# Altium project TM_DE_Display_REV1.0.PrjPcb
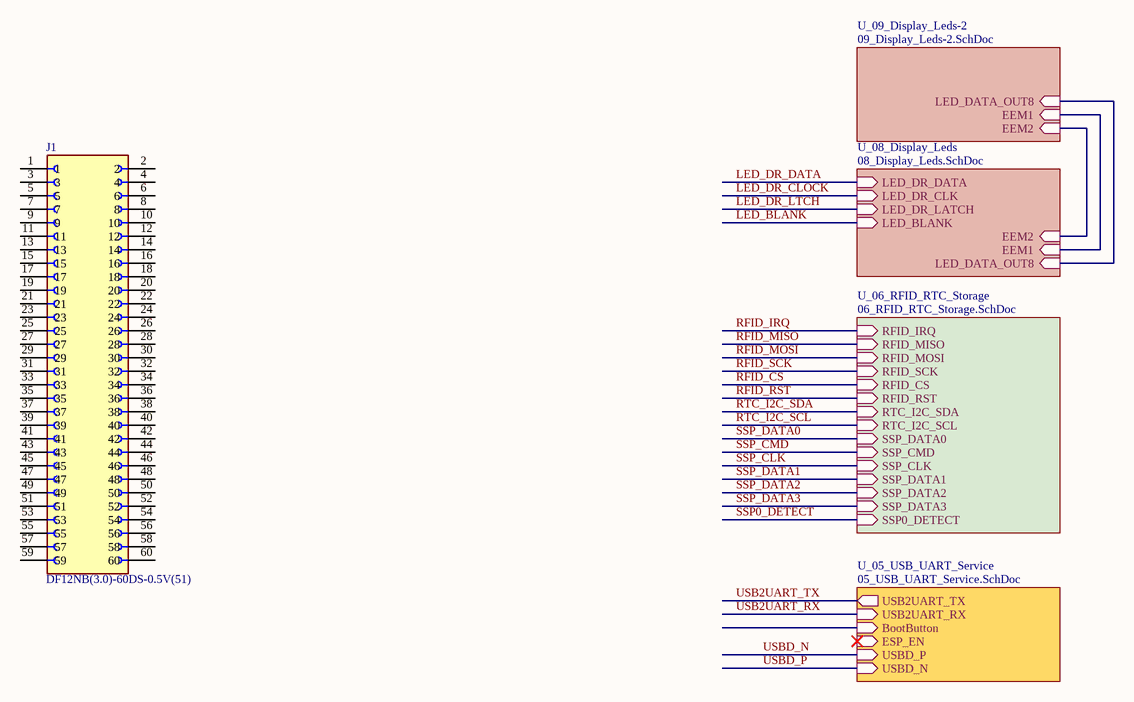
[diagram p0: TOP.SchDoc]
5 sheets, 284 parts. Net scope: hierarchical (ports join the sheet entries above them; power ports are global).
Board file: TM_DE_Display_REV1.0.PcbDoc
Sheets:
  TOP.SchDoc
    U_08_Display_Leds = 08_Display_Leds.SchDoc
    U_09_Display_Leds-2 = 09_Display_Leds-2.SchDoc
    U_05_USB_UART_Service = 05_USB_UART_Service.SchDoc
    U_06_RFID_RTC_Storage = 06_RFID_RTC_Storage.SchDoc

## Sheet TOP.SchDoc: TAXIMETRE_PCB_MAIN
size A4; Author: Burak YALIM; CompanyName: BARFAS; DrawnBy: Burak YALIM; DocumentNumber: 0; SheetNumber: 1; SheetTotal: 12

### Parts
J1  DF12NB(3.0)-60DS-0.5V(51)  [HRS_DF12NB(3.0)-60DS-0.5V(51)]

### Sub-sheets
U_05_USB_UART_Service = 05_USB_UART_Service.SchDoc: USB2UART_TX (out), USB2UART_RX (in), BootButton (in), ESP_EN (in), USBD_P (in), USBD_N (in)
U_06_RFID_RTC_Storage = 06_RFID_RTC_Storage.SchDoc: RFID_IRQ (in), RFID_MISO (in), RFID_MOSI (in), RFID_SCK (in), RFID_CS (in), RFID_RST (in), RTC_I2C_SDA (in), RTC_I2C_SCL (in), SSP_DATA0 (in), SSP_CMD (in), SSP_CLK (in), SSP_DATA1 (in), SSP_DATA2 (in), SSP_DATA3 (in), SSP0_DETECT (in)
U_08_Display_Leds = 08_Display_Leds.SchDoc: LED_DR_DATA (in), LED_DR_CLK (in), LED_DR_LATCH (in), LED_BLANK (in), LED_DATA_OUT8 (in), EEM1 (in), EEM2 (in)
U_09_Display_Leds-2 = 09_Display_Leds-2.SchDoc: LED_DATA_OUT8 (in), EEM1 (in), EEM2 (in)

### Nets
EEM1: sheet U_08_Display_Leds/EEM1, sheet U_09_Display_Leds-2/EEM1
EEM2: sheet U_08_Display_Leds/EEM2, sheet U_09_Display_Leds-2/EEM2
NetU18_22: sheet U_08_Display_Leds/LED_DATA_OUT8, sheet U_09_Display_Leds-2/LED_DATA_OUT8

Not connected (* = marked no-connect by the designer): J1 1 2 3 4 5 6 7 8 9 10 11 12 13 14 15 16 17 18 19 20 21 22 23 24 25 26 27 28 29 30 31 32 33 34 35 36 37 38 39 40 41 42 43 44 45 46 47 48 49 50 51 52 53 54 55 56 57 58 59 60

### Notes on the sheet
- Title
- Size:
- Date:
- A4
- Drawn By:
- Number:
- Revision:
- File:

### Library data of the parts
J1 = DF12NB(3.0)-60DS-0.5V(51): 60 Position Connector Receptacle, Center Strip Contacts Surface Mount Gold; MF: Hirose Electric Co Ltd; SnapEDA_Link: https://www.snapeda.com/parts/DF12NB(3.0)-60DS-0.5V(51)/Hirose/view-part/?ref=snap; Package: None; Value: *; MP: DF12NB(3.0)-60DS-0.5V(51); Check_prices: https://www.snapeda.com/parts/DF12NB(3.0)-60DS-0.5V(51)/Hirose/view-part/?ref=eda

## Sheet 08_Display_Leds.SchDoc
size 558 x 431 mm; SheetNumber: 9; SheetTotal: 12
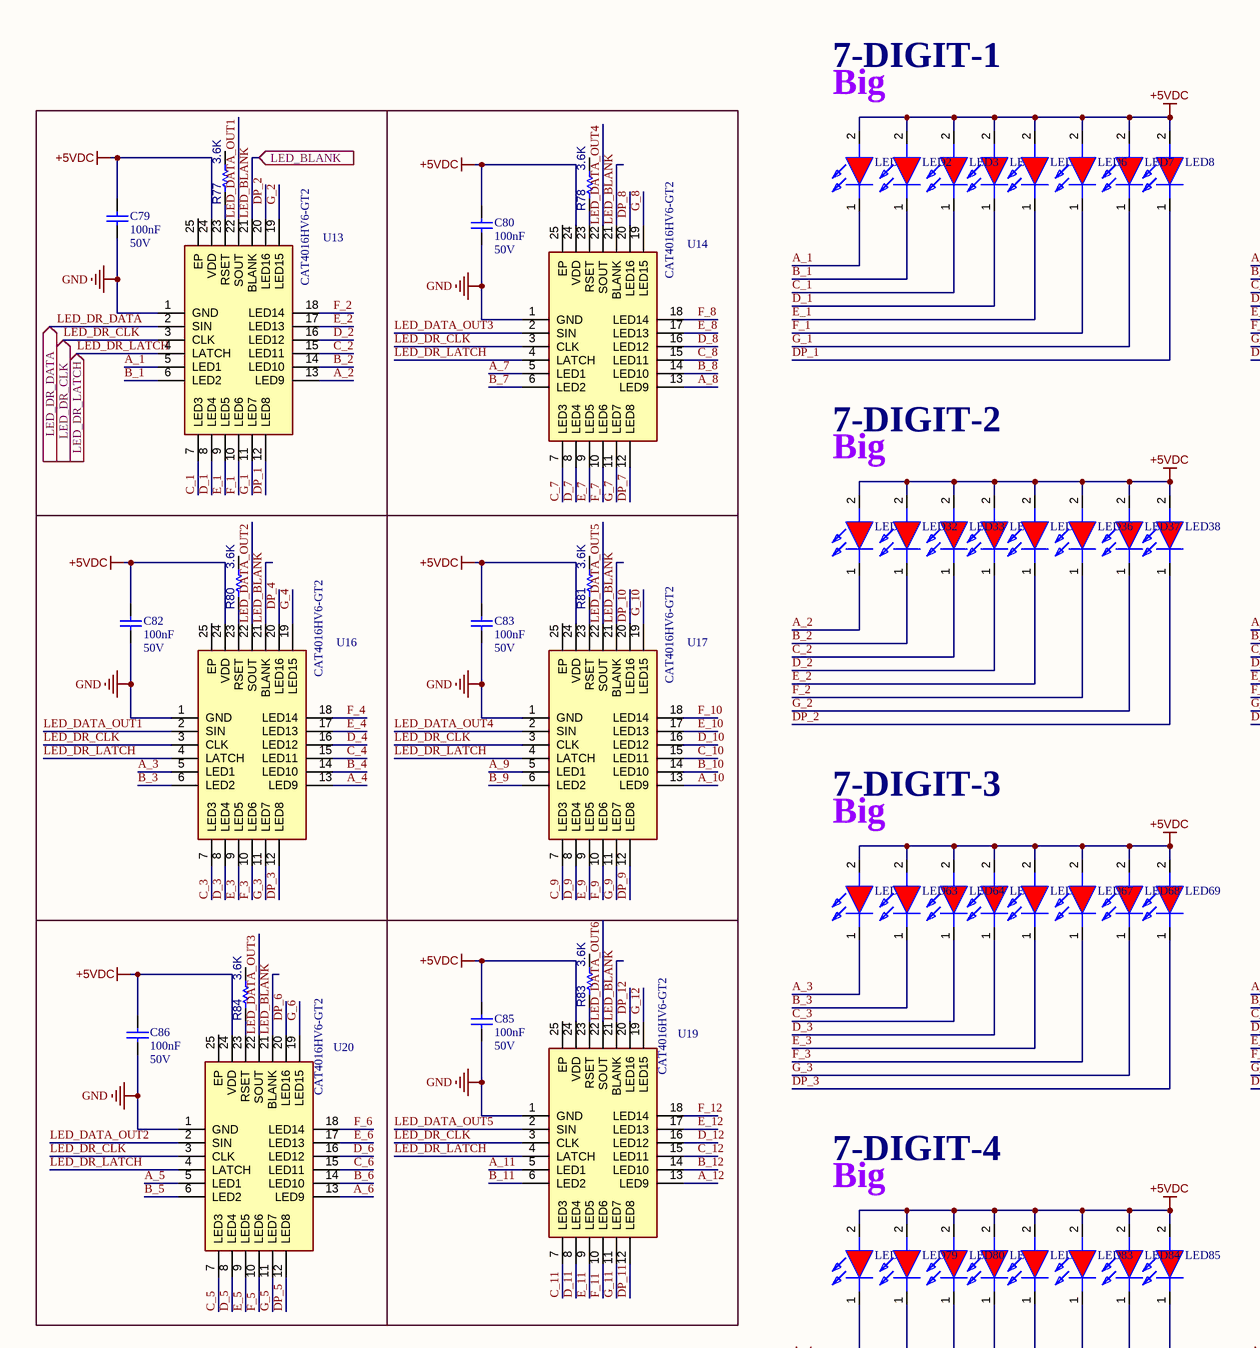
[diagram p1: 08_Display_Leds.SchDoc, top left]
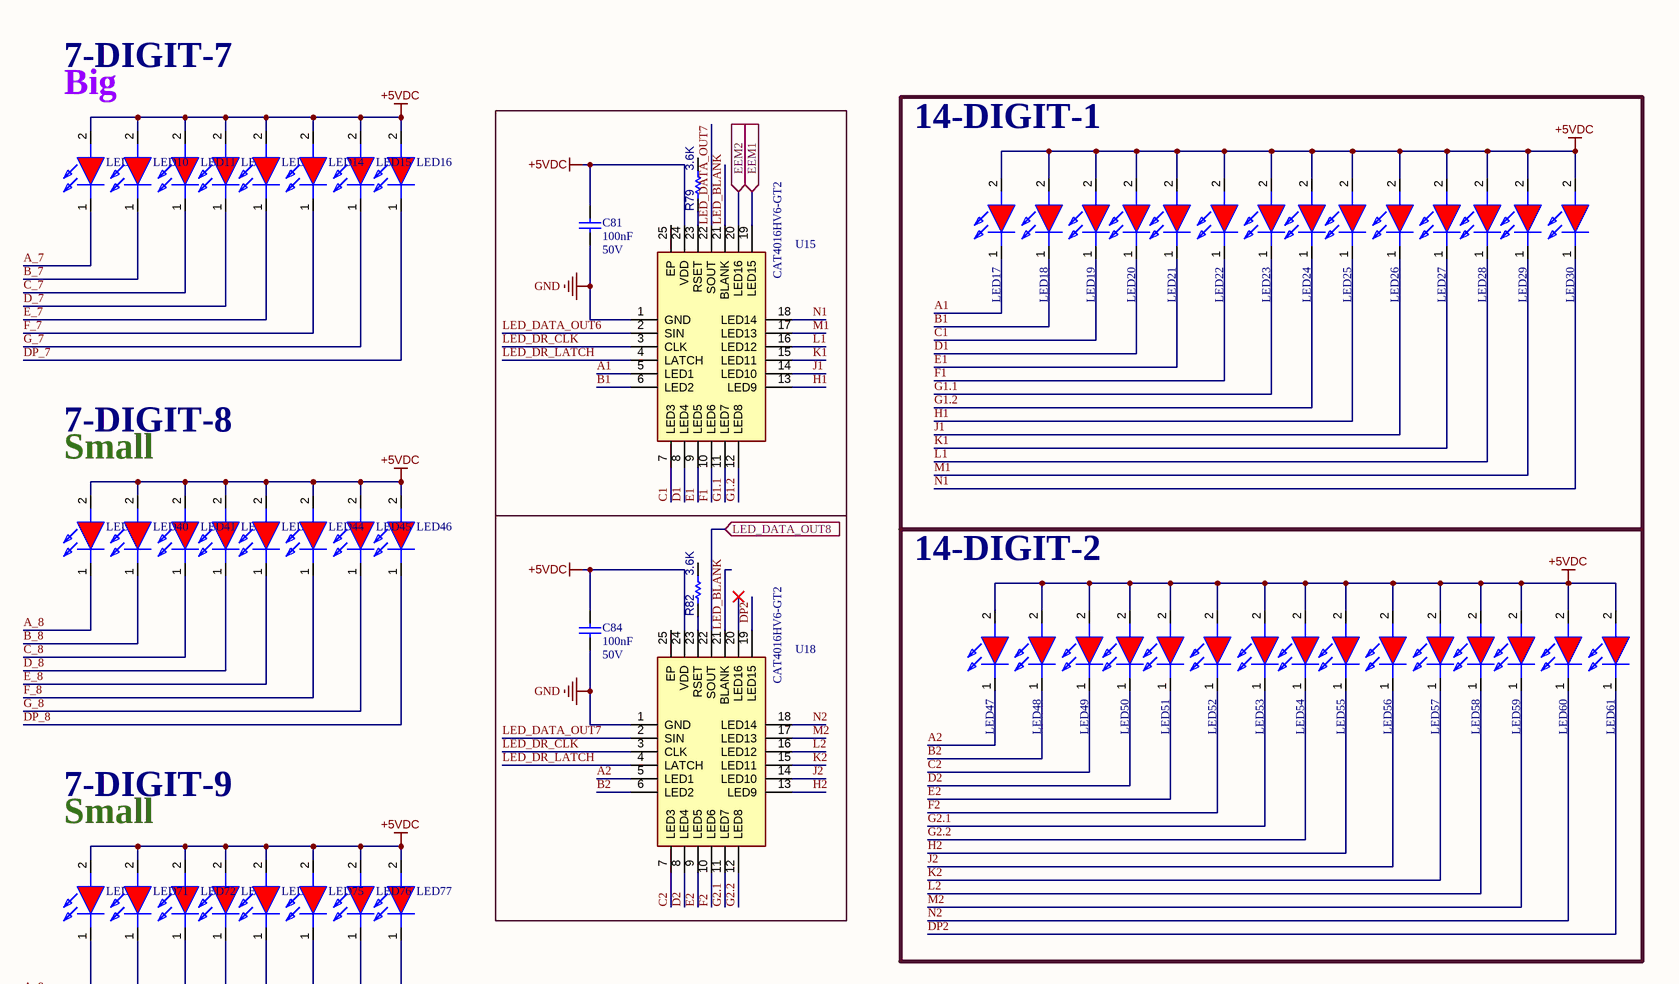
[diagram p2: 08_Display_Leds.SchDoc, top right]
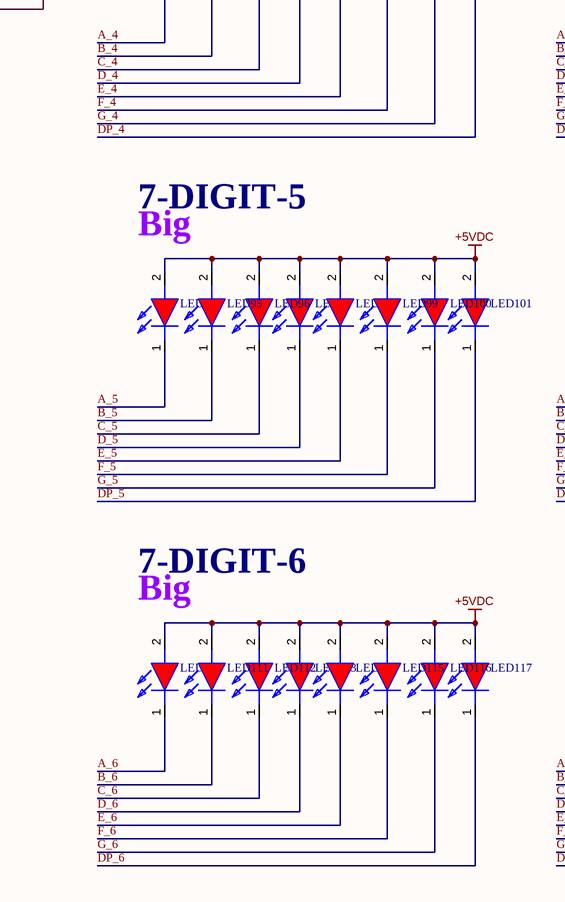
[diagram p3: 08_Display_Leds.SchDoc, bottom left]
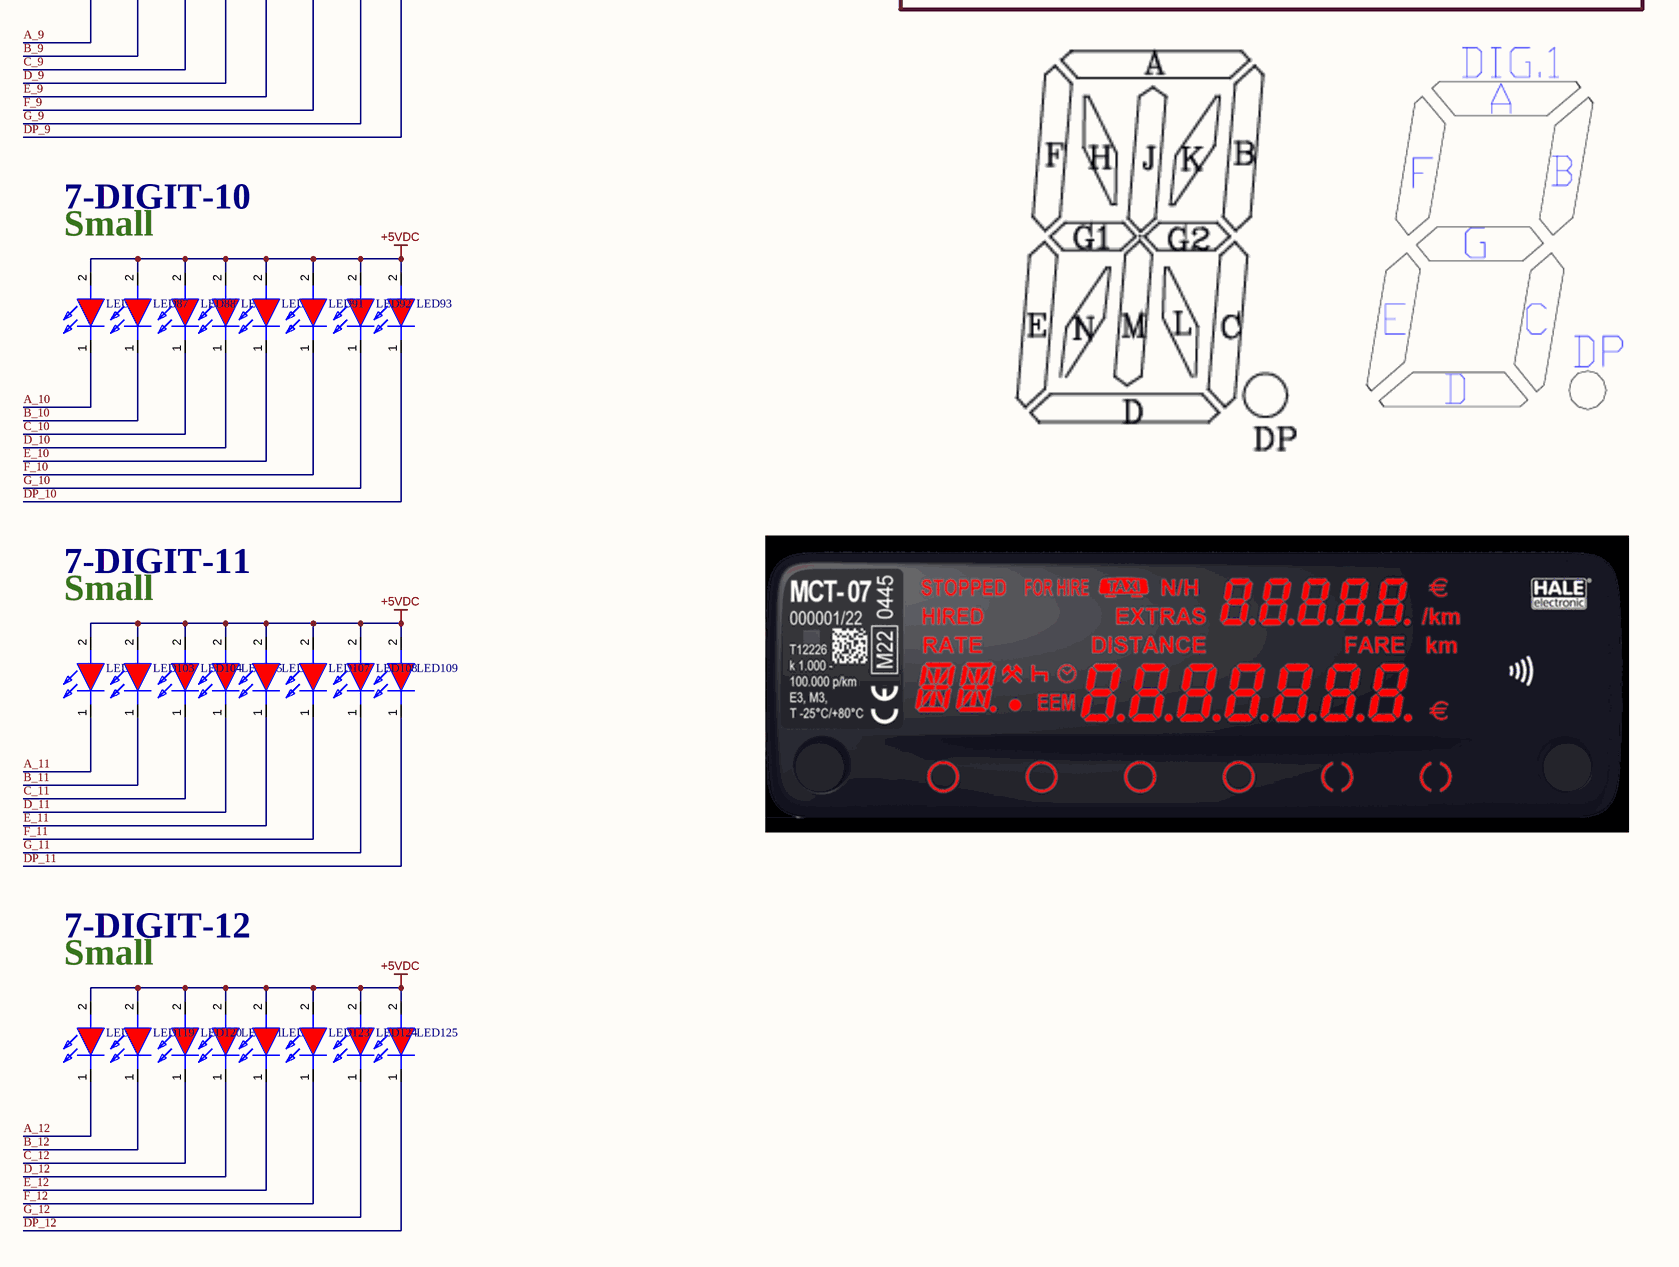
[diagram p4: 08_Display_Leds.SchDoc, bottom right]

### Parts
C79  value 100nF  Voltage: 50V  [CAP_0603]  (hidden comment: CAP)
C80  value 100nF  Voltage: 50V  [CAP_0603]  (hidden comment: CAP)
C81  value 100nF  Voltage: 50V  [CAP_0603]  (hidden comment: CAP)
C82  value 100nF  Voltage: 50V  [CAP_0603]  (hidden comment: CAP)
C83  value 100nF  Voltage: 50V  [CAP_0603]  (hidden comment: CAP)
C84  value 100nF  Voltage: 50V  [CAP_0603]  (hidden comment: CAP)
C85  value 100nF  Voltage: 50V  [CAP_0603]  (hidden comment: CAP)
C86  value 100nF  Voltage: 50V  [CAP_0603]  (hidden comment: CAP)
LED1  YLED0402R  [APHHS1005LSECKJ3PF]  (value not drawn)
LED2  YLED0402R  [APHHS1005LSECKJ3PF]  (value not drawn)
LED3  YLED0402R  [APHHS1005LSECKJ3PF]  (value not drawn)
LED4  YLED0402R  [APHHS1005LSECKJ3PF]  (value not drawn)
LED5  YLED0402R  [APHHS1005LSECKJ3PF]  (value not drawn)
LED6  YLED0402R  [APHHS1005LSECKJ3PF]  (value not drawn)
LED7  YLED0402R  [APHHS1005LSECKJ3PF]  (value not drawn)
LED8  YLED0402R  [APHHS1005LSECKJ3PF]  (value not drawn)
LED9  YLED0402R  [APHHS1005LSECKJ3PF]  (value not drawn)
LED10  YLED0402R  [APHHS1005LSECKJ3PF]  (value not drawn)
LED11  YLED0402R  [APHHS1005LSECKJ3PF]  (value not drawn)
LED12  YLED0402R  [APHHS1005LSECKJ3PF]  (value not drawn)
LED13  YLED0402R  [APHHS1005LSECKJ3PF]  (value not drawn)
LED14  YLED0402R  [APHHS1005LSECKJ3PF]  (value not drawn)
LED15  YLED0402R  [APHHS1005LSECKJ3PF]  (value not drawn)
LED16  YLED0402R  [APHHS1005LSECKJ3PF]  (value not drawn)
LED17  YLED0402R  [APHHS1005LSECKJ3PF]  (value not drawn)
LED18  YLED0402R  [APHHS1005LSECKJ3PF]  (value not drawn)
LED19  YLED0402R  [APHHS1005LSECKJ3PF]  (value not drawn)
LED20  YLED0402R  [APHHS1005LSECKJ3PF]  (value not drawn)
LED21  YLED0402R  [APHHS1005LSECKJ3PF]  (value not drawn)
LED22  YLED0402R  [APHHS1005LSECKJ3PF]  (value not drawn)
LED23  YLED0402R  [APHHS1005LSECKJ3PF]  (value not drawn)
LED24  YLED0402R  [APHHS1005LSECKJ3PF]  (value not drawn)
LED25  YLED0402R  [APHHS1005LSECKJ3PF]  (value not drawn)
LED26  YLED0402R  [APHHS1005LSECKJ3PF]  (value not drawn)
LED27  YLED0402R  [APHHS1005LSECKJ3PF]  (value not drawn)
LED28  YLED0402R  [APHHS1005LSECKJ3PF]  (value not drawn)
LED29  YLED0402R  [APHHS1005LSECKJ3PF]  (value not drawn)
LED30  YLED0402R  [APHHS1005LSECKJ3PF]  (value not drawn)
LED31  YLED0402R  [APHHS1005LSECKJ3PF]  (value not drawn)
LED32  YLED0402R  [APHHS1005LSECKJ3PF]  (value not drawn)
LED33  YLED0402R  [APHHS1005LSECKJ3PF]  (value not drawn)
LED34  YLED0402R  [APHHS1005LSECKJ3PF]  (value not drawn)
LED35  YLED0402R  [APHHS1005LSECKJ3PF]  (value not drawn)
LED36  YLED0402R  [APHHS1005LSECKJ3PF]  (value not drawn)
LED37  YLED0402R  [APHHS1005LSECKJ3PF]  (value not drawn)
LED38  YLED0402R  [APHHS1005LSECKJ3PF]  (value not drawn)
LED39  YLED0402R  [APHHS1005LSECKJ3PF]  (value not drawn)
LED40  YLED0402R  [APHHS1005LSECKJ3PF]  (value not drawn)
LED41  YLED0402R  [APHHS1005LSECKJ3PF]  (value not drawn)
LED42  YLED0402R  [APHHS1005LSECKJ3PF]  (value not drawn)
LED43  YLED0402R  [APHHS1005LSECKJ3PF]  (value not drawn)
LED44  YLED0402R  [APHHS1005LSECKJ3PF]  (value not drawn)
LED45  YLED0402R  [APHHS1005LSECKJ3PF]  (value not drawn)
LED46  YLED0402R  [APHHS1005LSECKJ3PF]  (value not drawn)
LED47  YLED0402R  [APHHS1005LSECKJ3PF]  (value not drawn)
LED48  YLED0402R  [APHHS1005LSECKJ3PF]  (value not drawn)
LED49  YLED0402R  [APHHS1005LSECKJ3PF]  (value not drawn)
LED50  YLED0402R  [APHHS1005LSECKJ3PF]  (value not drawn)
LED51  YLED0402R  [APHHS1005LSECKJ3PF]  (value not drawn)
LED52  YLED0402R  [APHHS1005LSECKJ3PF]  (value not drawn)
LED53  YLED0402R  [APHHS1005LSECKJ3PF]  (value not drawn)
LED54  YLED0402R  [APHHS1005LSECKJ3PF]  (value not drawn)
LED55  YLED0402R  [APHHS1005LSECKJ3PF]  (value not drawn)
LED56  YLED0402R  [APHHS1005LSECKJ3PF]  (value not drawn)
LED57  YLED0402R  [APHHS1005LSECKJ3PF]  (value not drawn)
LED58  YLED0402R  [APHHS1005LSECKJ3PF]  (value not drawn)
LED59  YLED0402R  [APHHS1005LSECKJ3PF]  (value not drawn)
LED60  YLED0402R  [APHHS1005LSECKJ3PF]  (value not drawn)
LED61  YLED0402R  [APHHS1005LSECKJ3PF]  (value not drawn)
LED62  YLED0402R  [APHHS1005LSECKJ3PF]  (value not drawn)
LED63  YLED0402R  [APHHS1005LSECKJ3PF]  (value not drawn)
LED64  YLED0402R  [APHHS1005LSECKJ3PF]  (value not drawn)
LED65  YLED0402R  [APHHS1005LSECKJ3PF]  (value not drawn)
LED66  YLED0402R  [APHHS1005LSECKJ3PF]  (value not drawn)
LED67  YLED0402R  [APHHS1005LSECKJ3PF]  (value not drawn)
LED68  YLED0402R  [APHHS1005LSECKJ3PF]  (value not drawn)
LED69  YLED0402R  [APHHS1005LSECKJ3PF]  (value not drawn)
LED70  YLED0402R  [APHHS1005LSECKJ3PF]  (value not drawn)
LED71  YLED0402R  [APHHS1005LSECKJ3PF]  (value not drawn)
LED72  YLED0402R  [APHHS1005LSECKJ3PF]  (value not drawn)
LED73  YLED0402R  [APHHS1005LSECKJ3PF]  (value not drawn)
LED74  YLED0402R  [APHHS1005LSECKJ3PF]  (value not drawn)
LED75  YLED0402R  [APHHS1005LSECKJ3PF]  (value not drawn)
LED76  YLED0402R  [APHHS1005LSECKJ3PF]  (value not drawn)
LED77  YLED0402R  [APHHS1005LSECKJ3PF]  (value not drawn)
LED78  YLED0402R  [APHHS1005LSECKJ3PF]  (value not drawn)
LED79  YLED0402R  [APHHS1005LSECKJ3PF]  (value not drawn)
LED80  YLED0402R  [APHHS1005LSECKJ3PF]  (value not drawn)
LED81  YLED0402R  [APHHS1005LSECKJ3PF]  (value not drawn)
LED82  YLED0402R  [APHHS1005LSECKJ3PF]  (value not drawn)
LED83  YLED0402R  [APHHS1005LSECKJ3PF]  (value not drawn)
LED84  YLED0402R  [APHHS1005LSECKJ3PF]  (value not drawn)
LED85  YLED0402R  [APHHS1005LSECKJ3PF]  (value not drawn)
LED86  YLED0402R  [APHHS1005LSECKJ3PF]  (value not drawn)
LED87  YLED0402R  [APHHS1005LSECKJ3PF]  (value not drawn)
LED88  YLED0402R  [APHHS1005LSECKJ3PF]  (value not drawn)
LED89  YLED0402R  [APHHS1005LSECKJ3PF]  (value not drawn)
LED90  YLED0402R  [APHHS1005LSECKJ3PF]  (value not drawn)
LED91  YLED0402R  [APHHS1005LSECKJ3PF]  (value not drawn)
LED92  YLED0402R  [APHHS1005LSECKJ3PF]  (value not drawn)
LED93  YLED0402R  [APHHS1005LSECKJ3PF]  (value not drawn)
LED94  YLED0402R  [APHHS1005LSECKJ3PF]  (value not drawn)
LED95  YLED0402R  [APHHS1005LSECKJ3PF]  (value not drawn)
LED96  YLED0402R  [APHHS1005LSECKJ3PF]  (value not drawn)
LED97  YLED0402R  [APHHS1005LSECKJ3PF]  (value not drawn)
LED98  YLED0402R  [APHHS1005LSECKJ3PF]  (value not drawn)
LED99  YLED0402R  [APHHS1005LSECKJ3PF]  (value not drawn)
LED100  YLED0402R  [APHHS1005LSECKJ3PF]  (value not drawn)
LED101  YLED0402R  [APHHS1005LSECKJ3PF]  (value not drawn)
LED102  YLED0402R  [APHHS1005LSECKJ3PF]  (value not drawn)
LED103  YLED0402R  [APHHS1005LSECKJ3PF]  (value not drawn)
LED104  YLED0402R  [APHHS1005LSECKJ3PF]  (value not drawn)
LED105  YLED0402R  [APHHS1005LSECKJ3PF]  (value not drawn)
LED106  YLED0402R  [APHHS1005LSECKJ3PF]  (value not drawn)
LED107  YLED0402R  [APHHS1005LSECKJ3PF]  (value not drawn)
LED108  YLED0402R  [APHHS1005LSECKJ3PF]  (value not drawn)
LED109  YLED0402R  [APHHS1005LSECKJ3PF]  (value not drawn)
LED110  YLED0402R  [APHHS1005LSECKJ3PF]  (value not drawn)
LED111  YLED0402R  [APHHS1005LSECKJ3PF]  (value not drawn)
LED112  YLED0402R  [APHHS1005LSECKJ3PF]  (value not drawn)
LED113  YLED0402R  [APHHS1005LSECKJ3PF]  (value not drawn)
LED114  YLED0402R  [APHHS1005LSECKJ3PF]  (value not drawn)
LED115  YLED0402R  [APHHS1005LSECKJ3PF]  (value not drawn)
LED116  YLED0402R  [APHHS1005LSECKJ3PF]  (value not drawn)
LED117  YLED0402R  [APHHS1005LSECKJ3PF]  (value not drawn)
LED118  YLED0402R  [APHHS1005LSECKJ3PF]  (value not drawn)
LED119  YLED0402R  [APHHS1005LSECKJ3PF]  (value not drawn)
LED120  YLED0402R  [APHHS1005LSECKJ3PF]  (value not drawn)
LED121  YLED0402R  [APHHS1005LSECKJ3PF]  (value not drawn)
LED122  YLED0402R  [APHHS1005LSECKJ3PF]  (value not drawn)
LED123  YLED0402R  [APHHS1005LSECKJ3PF]  (value not drawn)
LED124  YLED0402R  [APHHS1005LSECKJ3PF]  (value not drawn)
LED125  YLED0402R  [APHHS1005LSECKJ3PF]  (value not drawn)
R77  value 3.6K  [RES_0603]  (hidden comment: RC0603FR-133K6L)
R78  value 3.6K  [RES_0603]  (hidden comment: RC0603FR-133K6L)
R79  value 3.6K  [RES_0603]  (hidden comment: RC0603FR-133K6L)
R80  value 3.6K  [RES_0603]  (hidden comment: RC0603FR-133K6L)
R81  value 3.6K  [RES_0603]  (hidden comment: RC0603FR-133K6L)
R82  value 3.6K  [RES_0603]  (hidden comment: RC0603FR-133K6L)
R83  value 3.6K  [RES_0603]  (hidden comment: RC0603FR-133K6L)
R84  value 3.6K  [RES_0603]  (hidden comment: RC0603FR-133K6L)
U13  CAT4016HV6-GT2  [QFN50P400X400X80-25N-D]
U14  CAT4016HV6-GT2  [QFN50P400X400X80-25N-D]
U15  CAT4016HV6-GT2  [QFN50P400X400X80-25N-D]
U16  CAT4016HV6-GT2  [QFN50P400X400X80-25N-D]
U17  CAT4016HV6-GT2  [QFN50P400X400X80-25N-D]
U18  CAT4016HV6-GT2  [QFN50P400X400X80-25N-D]
U19  CAT4016HV6-GT2  [QFN50P400X400X80-25N-D]
U20  CAT4016HV6-GT2  [QFN50P400X400X80-25N-D]

### Blocks framed on the sheet
14-DIGIT-1: LED17-LED30
14-DIGIT-2: LED47-LED61

### Ports
EEM1 (in), EEM2 (in), LED_BLANK (in), LED_DATA_OUT8 (in), LED_DR_CLK (in), LED_DR_DATA (in), LED_DR_LATCH (in)

### Nets
+5VDC: C79.1 C80.1 C81.1 C82.1 C83.1 C84.1 C85.1 C86.1 LED1.2(A) LED2.2(A) LED3.2(A) LED4.2(A) LED5.2(A) LED6.2(A) LED7.2(A) LED8.2(A) LED9.2(A) LED10.2(A) LED11.2(A) LED12.2(A) LED13.2(A) LED14.2(A) LED15.2(A) LED16.2(A) LED17.2(A) LED18.2(A) LED19.2(A) LED20.2(A) LED21.2(A) LED22.2(A) LED23.2(A) LED24.2(A) LED25.2(A) LED26.2(A) LED27.2(A) LED28.2(A) LED29.2(A) LED30.2(A) LED31.2(A) LED32.2(A) LED33.2(A) LED34.2(A) LED35.2(A) LED36.2(A) LED37.2(A) LED38.2(A) LED39.2(A) LED40.2(A) LED41.2(A) LED42.2(A) LED43.2(A) LED44.2(A) LED45.2(A) LED46.2(A) LED47.2(A) LED48.2(A) LED49.2(A) LED50.2(A) LED51.2(A) LED52.2(A) LED53.2(A) LED54.2(A) LED55.2(A) LED56.2(A) LED57.2(A) LED58.2(A) LED59.2(A) LED60.2(A) LED61.2(A) LED62.2(A) LED63.2(A) LED64.2(A) LED65.2(A) LED66.2(A) LED67.2(A) LED68.2(A) LED69.2(A) LED70.2(A) LED71.2(A) LED72.2(A) LED73.2(A) LED74.2(A) LED75.2(A) LED76.2(A) LED77.2(A) LED78.2(A) LED79.2(A) LED80.2(A) LED81.2(A) LED82.2(A) LED83.2(A) LED84.2(A) LED85.2(A) LED86.2(A) LED87.2(A) LED88.2(A) LED89.2(A) LED90.2(A) LED91.2(A) LED92.2(A) LED93.2(A) LED94.2(A) LED95.2(A) LED96.2(A) LED97.2(A) LED98.2(A) LED99.2(A) LED100.2(A) LED101.2(A) LED102.2(A) LED103.2(A) LED104.2(A) LED105.2(A) LED106.2(A) LED107.2(A) LED108.2(A) LED109.2(A) LED110.2(A) LED111.2(A) LED112.2(A) LED113.2(A) LED114.2(A) LED115.2(A) LED116.2(A) LED117.2(A) LED118.2(A) LED119.2(A) LED120.2(A) LED121.2(A) LED122.2(A) LED123.2(A) LED124.2(A) LED125.2(A) U13.24(VDD) U14.24(VDD) U15.24(VDD) U16.24(VDD) U17.24(VDD) U18.24(VDD) U19.24(VDD) U20.24(VDD)
GND: C79.2 C80.2 C81.2 C82.2 C83.2 C84.2 C85.2 C86.2 U13.1(GND) U14.1(GND) U15.1(GND) U16.1(GND) U17.1(GND) U18.1(GND) U19.1(GND) U20.1(GND)
A1: LED17.1(K) U15.5(LED1)
A2: LED47.1(K) U18.5(LED1)
A_1: LED1.1(K) U13.5(LED1)
A_2: LED31.1(K) U13.13(LED9)
A_3: LED62.1(K) U16.5(LED1)
A_4: LED78.1(K) U16.13(LED9)
A_5: LED94.1(K) U20.5(LED1)
A_6: LED110.1(K) U20.13(LED9)
A_7: LED9.1(K) U14.5(LED1)
A_8: LED39.1(K) U14.13(LED9)
A_9: LED70.1(K) U17.5(LED1)
A_10: LED86.1(K) U17.13(LED9)
A_11: LED102.1(K) U19.5(LED1)
A_12: LED118.1(K) U19.13(LED9)
B1: LED18.1(K) U15.6(LED2)
B2: LED48.1(K) U18.6(LED2)
B_1: LED2.1(K) U13.6(LED2)
B_2: LED32.1(K) U13.14(LED10)
B_3: LED63.1(K) U16.6(LED2)
B_4: LED79.1(K) U16.14(LED10)
B_5: LED95.1(K) U20.6(LED2)
B_6: LED111.1(K) U20.14(LED10)
B_7: LED10.1(K) U14.6(LED2)
B_8: LED40.1(K) U14.14(LED10)
B_9: LED71.1(K) U17.6(LED2)
B_10: LED87.1(K) U17.14(LED10)
B_11: LED103.1(K) U19.6(LED2)
B_12: LED119.1(K) U19.14(LED10)
C1: LED19.1(K) U15.7(LED3)
C2: LED49.1(K) U18.7(LED3)
C_1: LED3.1(K) U13.7(LED3)
C_2: LED33.1(K) U13.15(LED11)
C_3: LED64.1(K) U16.7(LED3)
C_4: LED80.1(K) U16.15(LED11)
C_5: LED96.1(K) U20.7(LED3)
C_6: LED112.1(K) U20.15(LED11)
C_7: LED11.1(K) U14.7(LED3)
C_8: LED41.1(K) U14.15(LED11)
C_9: LED72.1(K) U17.7(LED3)
C_10: LED88.1(K) U17.15(LED11)
C_11: LED104.1(K) U19.7(LED3)
C_12: LED120.1(K) U19.15(LED11)
D1: LED20.1(K) U15.8(LED4)
D2: LED50.1(K) U18.8(LED4)
D_1: LED4.1(K) U13.8(LED4)
D_2: LED34.1(K) U13.16(LED12)
D_3: LED65.1(K) U16.8(LED4)
D_4: LED81.1(K) U16.16(LED12)
D_5: LED97.1(K) U20.8(LED4)
D_6: LED113.1(K) U20.16(LED12)
D_7: LED12.1(K) U14.8(LED4)
D_8: LED42.1(K) U14.16(LED12)
D_9: LED73.1(K) U17.8(LED4)
D_10: LED89.1(K) U17.16(LED12)
D_11: LED105.1(K) U19.8(LED4)
D_12: LED121.1(K) U19.16(LED12)
DP2: LED61.1(K) U18.19(LED15)
DP_1: LED8.1(K) U13.12(LED8)
DP_2: LED38.1(K) U13.20(LED16)
DP_3: LED69.1(K) U16.12(LED8)
DP_4: LED85.1(K) U16.20(LED16)
DP_5: LED101.1(K) U20.12(LED8)
DP_6: LED117.1(K) U20.20(LED16)
DP_7: LED16.1(K) U14.12(LED8)
DP_8: LED46.1(K) U14.20(LED16)
DP_9: LED77.1(K) U17.12(LED8)
DP_10: LED93.1(K) U17.20(LED16)
DP_11: LED109.1(K) U19.12(LED8)
DP_12: LED125.1(K) U19.20(LED16)
E1: LED21.1(K) U15.9(LED5)
E2: LED51.1(K) U18.9(LED5)
E_1: LED5.1(K) U13.9(LED5)
E_2: LED35.1(K) U13.17(LED13)
E_3: LED66.1(K) U16.9(LED5)
E_4: LED82.1(K) U16.17(LED13)
E_5: LED98.1(K) U20.9(LED5)
E_6: LED114.1(K) U20.17(LED13)
E_7: LED13.1(K) U14.9(LED5)
E_8: LED43.1(K) U14.17(LED13)
E_9: LED74.1(K) U17.9(LED5)
E_10: LED90.1(K) U17.17(LED13)
E_11: LED106.1(K) U19.9(LED5)
E_12: LED122.1(K) U19.17(LED13)
EEM1: U15.19(LED15) ; port EEM1
EEM2: U15.20(LED16) ; port EEM2
F1: LED22.1(K) U15.10(LED6)
F2: LED52.1(K) U18.10(LED6)
F_1: LED6.1(K) U13.10(LED6)
F_2: LED36.1(K) U13.18(LED14)
F_3: LED67.1(K) U16.10(LED6)
F_4: LED83.1(K) U16.18(LED14)
F_5: LED99.1(K) U20.10(LED6)
F_6: LED115.1(K) U20.18(LED14)
F_7: LED14.1(K) U14.10(LED6)
F_8: LED44.1(K) U14.18(LED14)
F_9: LED75.1(K) U17.10(LED6)
F_10: LED91.1(K) U17.18(LED14)
F_11: LED107.1(K) U19.10(LED6)
F_12: LED123.1(K) U19.18(LED14)
G1.1: LED23.1(K) U15.11(LED7)
G1.2: LED24.1(K) U15.12(LED8)
G2.1: LED53.1(K) U18.11(LED7)
G2.2: LED54.1(K) U18.12(LED8)
G_1: LED7.1(K) U13.11(LED7)
G_2: LED37.1(K) U13.19(LED15)
G_3: LED68.1(K) U16.11(LED7)
G_4: LED84.1(K) U16.19(LED15)
G_5: LED100.1(K) U20.11(LED7)
G_6: LED116.1(K) U20.19(LED15)
G_7: LED15.1(K) U14.11(LED7)
G_8: LED45.1(K) U14.19(LED15)
G_9: LED76.1(K) U17.11(LED7)
G_10: LED92.1(K) U17.19(LED15)
G_11: LED108.1(K) U19.11(LED7)
G_12: LED124.1(K) U19.19(LED15)
H1: LED25.1(K) U15.13(LED9)
H2: LED55.1(K) U18.13(LED9)
J1: LED26.1(K) U15.14(LED10)
J2: LED56.1(K) U18.14(LED10)
K1: LED27.1(K) U15.15(LED11)
K2: LED57.1(K) U18.15(LED11)
L1: LED28.1(K) U15.16(LED12)
L2: LED58.1(K) U18.16(LED12)
LED_BLANK: U13.21(BLANK) U14.21(BLANK) U15.21(BLANK) U16.21(BLANK) U17.21(BLANK) U18.21(BLANK) U19.21(BLANK) U20.21(BLANK) ; port LED_BLANK
LED_DATA_OUT1: U13.22(SOUT) U16.2(SIN)
LED_DATA_OUT2: U16.22(SOUT) U20.2(SIN)
LED_DATA_OUT3: U14.2(SIN) U20.22(SOUT)
LED_DATA_OUT4: U14.22(SOUT) U17.2(SIN)
LED_DATA_OUT5: U17.22(SOUT) U19.2(SIN)
LED_DATA_OUT6: U15.2(SIN) U19.22(SOUT)
LED_DATA_OUT7: U15.22(SOUT) U18.2(SIN)
LED_DR_CLK: U13.3(CLK) U14.3(CLK) U15.3(CLK) U16.3(CLK) U17.3(CLK) U18.3(CLK) U19.3(CLK) U20.3(CLK) ; port LED_DR_CLK
LED_DR_DATA: U13.2(SIN) ; port LED_DR_DATA
LED_DR_LATCH: U13.4(LATCH) U14.4(LATCH) U15.4(LATCH) U16.4(LATCH) U17.4(LATCH) U18.4(LATCH) U19.4(LATCH) U20.4(LATCH) ; port LED_DR_LATCH
M1: LED29.1(K) U15.17(LED13)
M2: LED59.1(K) U18.17(LED13)
N1: LED30.1(K) U15.18(LED14)
N2: LED60.1(K) U18.18(LED14)
NetR77_1: R77.1 U13.23(RSET)
NetR78_1: R78.1 U14.23(RSET)
NetR79_1: R79.1 U15.23(RSET)
NetR80_1: R80.1 U16.23(RSET)
NetR81_1: R81.1 U17.23(RSET)
NetR82_1: R82.1 U18.23(RSET)
NetR83_1: R83.1 U19.23(RSET)
NetR84_1: R84.1 U20.23(RSET)
NetU18_22: U18.22(SOUT) ; port LED_DATA_OUT8

Not connected (* = marked no-connect by the designer): R77 2; R78 2; R79 2; R80 2; R81 2; R82 2; R83 2; R84 2; U13 25(EP); U14 25(EP); U15 25(EP); U16 25(EP); U17 25(EP); U18 20(LED16)* 25(EP); U19 25(EP); U20 25(EP)

### Notes on the sheet
- 7-DIGIT-1
- Big
- 7-DIGIT-7
- 7-DIGIT-2
- 7-DIGIT-8
- Small
- 7-DIGIT-3
- 7-DIGIT-9
- 7-DIGIT-4
- 7-DIGIT-10
- 7-DIGIT-5
- 7-DIGIT-11
- 7-DIGIT-6
- 7-DIGIT-12
- DWG. NO.
- REV.
- SHT.
- REVISION
- DESCRIPTION
- DATE
- APPROVED
- THIS DOCUMENT AND THE DATA DISCLOSED HEREIN OR HEREWITH IS THE PROPERTY OF ALTIUM LIMITED AND MAY BE FREELY DISTRIBUTED IN WHOLE. NO RIGHTS ARE RESERVED OR EXPRESS OR IMPLIED WARANTEE GIVEN.
- ENG:
- DSN:
- APPROVALS
- PROJECT
- DOCUMENT REVISION:
- DESIGN ITEM:
- CHK:
- BOM:
- REFERENCE DOCUMENTS
- PROJECT REVISION:
- TITLE
- FAB DWG:
- PCB DWG:
- ASSY DWG:
- SCALE:
- SIZE
- C
- CAGE CODE
- FILE NAME
- DWG NO.
- SHEET
- OF
- REV

### Library data of the parts
C79-C86 = C01763: CAP CER 100nF 50VDC %10 X7R SMD; Manufacturer: Samsung; Manufacturer Part Number: CL10B104KB8NNNL
LED1-LED125 = YLED0402R: LED RED WATER CLEAR 0402 SMD; Manufacturer: Kingbright; Value: 0402; Manufacturer Part Number: YLED0402R
R77-R84 = 0603SAF3301T5E: RES.(1608) 0603 3.6K Ohms 1% 1/10W 100PPM SMT; Manufacturer: YAGEO; Manufacturer Part Number: RC0603FR-133K6L
U13-U20 = CAT4016HV6-GT2: Integrated Circuit; Manufacturer_Name: onsemi; Datasheet Link: https://www.onsemi.com/download/data-sheet/pdf/cat4016-d.pdf; Height: 0.8mm; Manufacturer_Part_Number: CAT4016HV6-GT2; Mouser Part Number: 698-CAT4016HV6-GT2; Mouser Price/Stock: https://www.mouser.co.uk/ProductDetail/onsemi/CAT4016HV6-GT2?qs=rZgeL6XvLwaPp0eUTTX%2FiA%3D%3D; Arrow Part Number: CAT4016HV6-GT2; Arrow Price/Stock: https://www.arrow.com/en/products/cat4016hv6-gt2/on-semiconductor

## Sheet 09_Display_Leds-2.SchDoc
size 558 x 431 mm; SheetNumber: 10; SheetTotal: 12
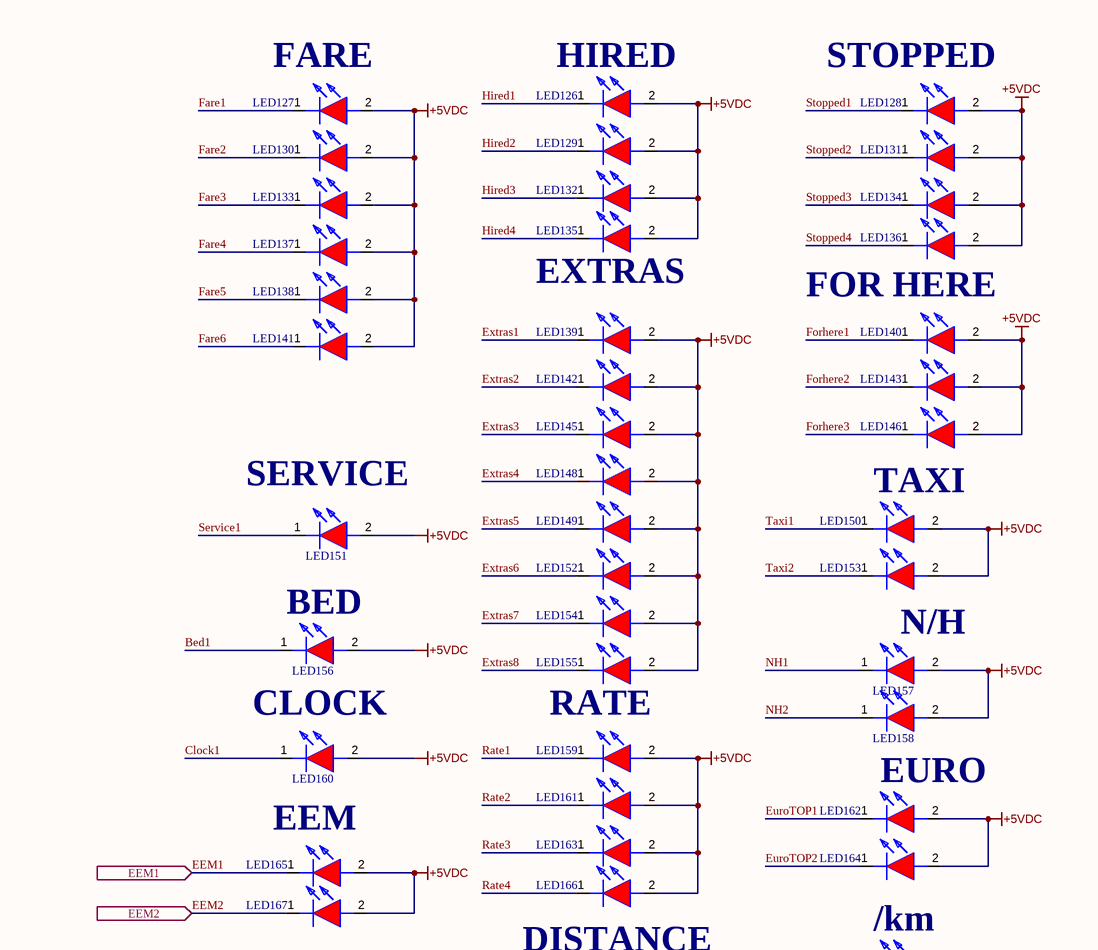
[diagram p5: 09_Display_Leds-2.SchDoc, top right]
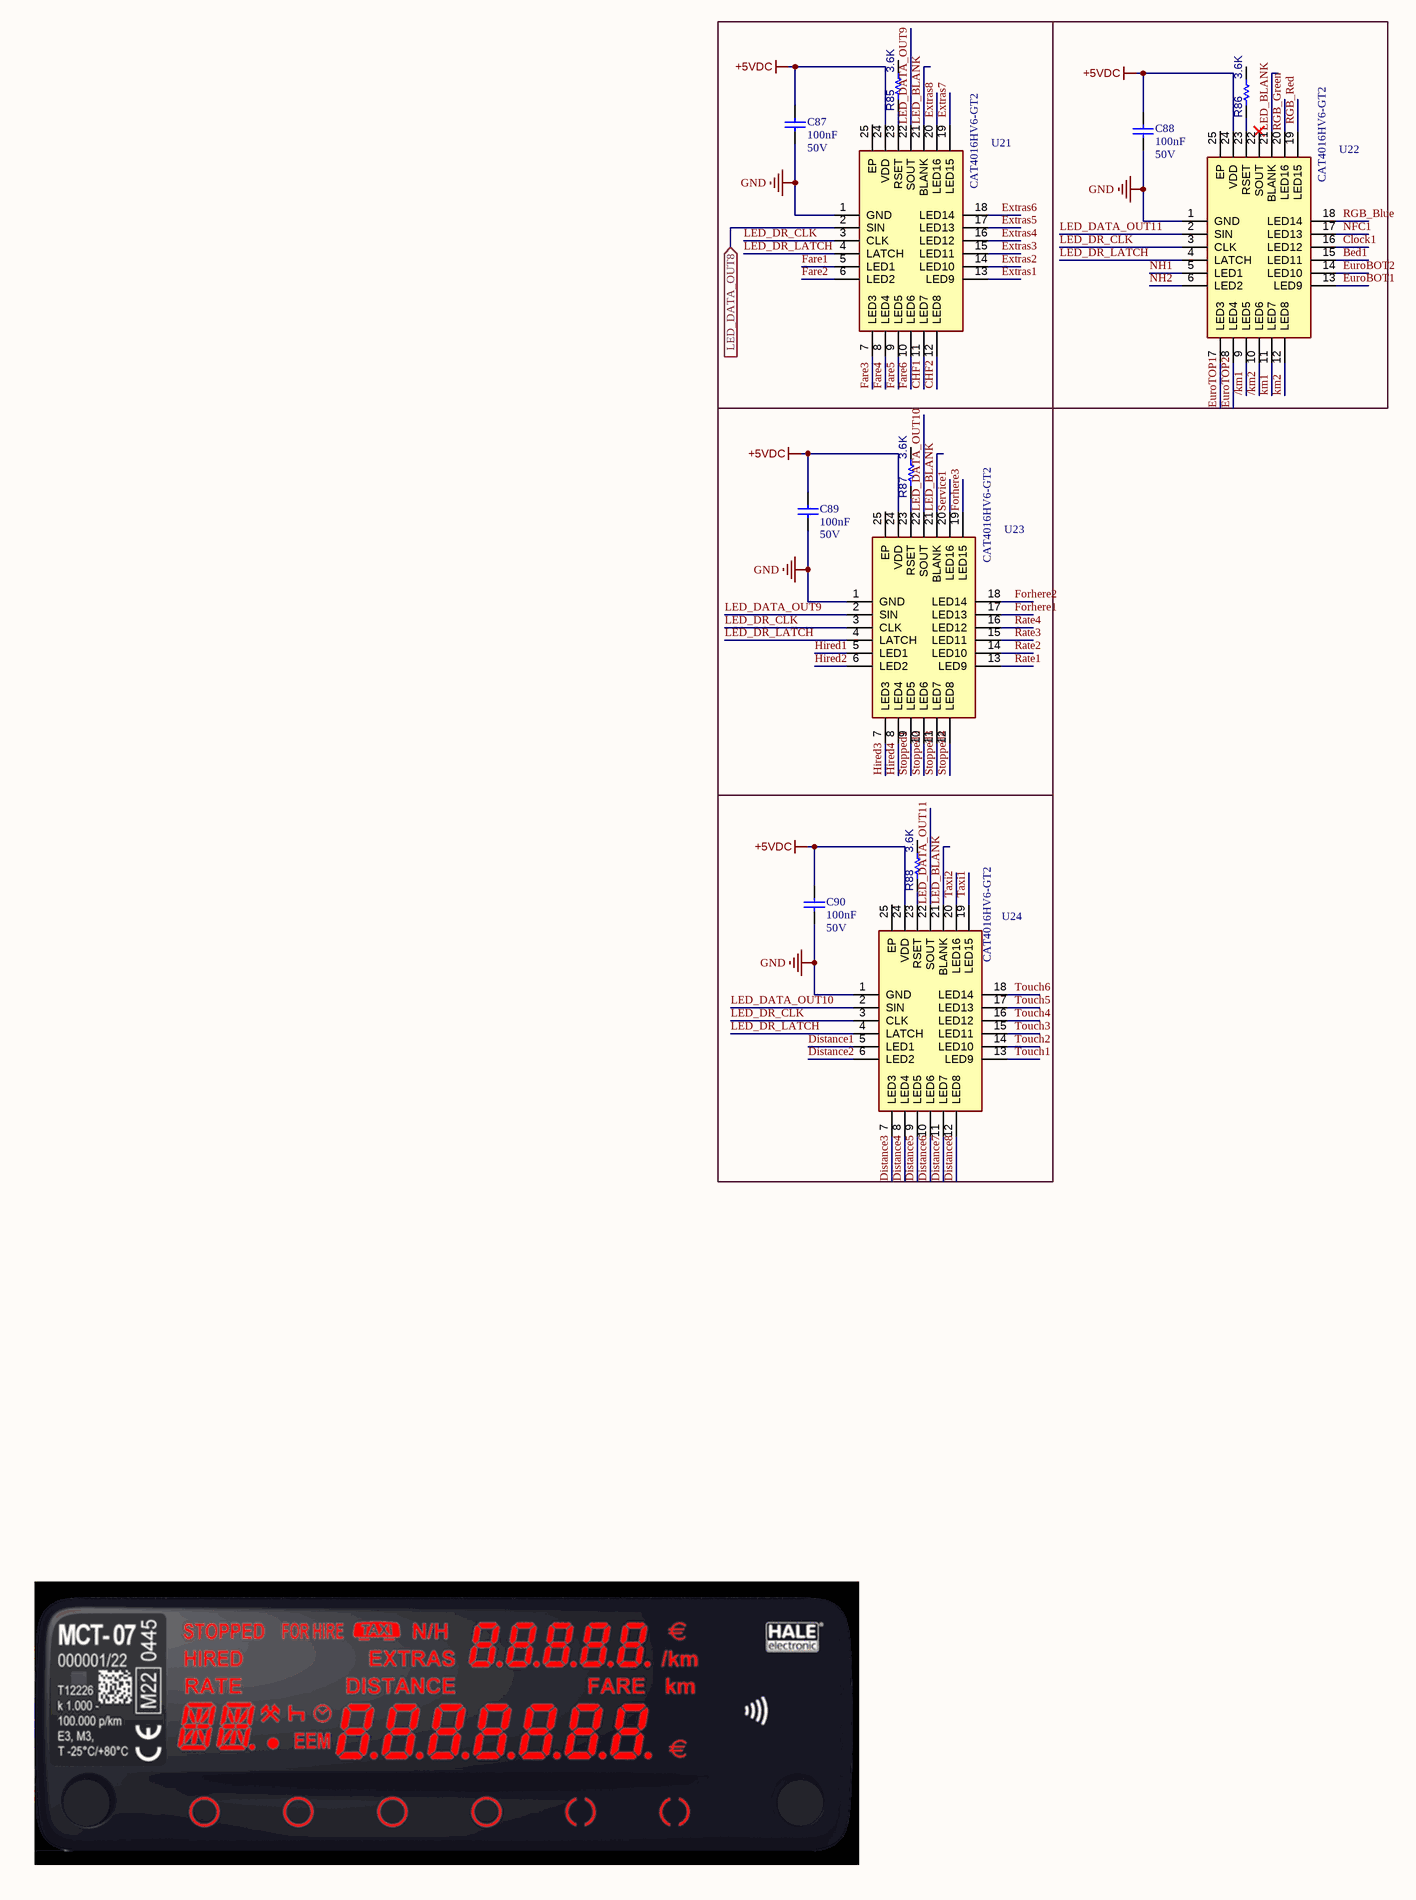
[diagram p6: 09_Display_Leds-2.SchDoc, bottom left]
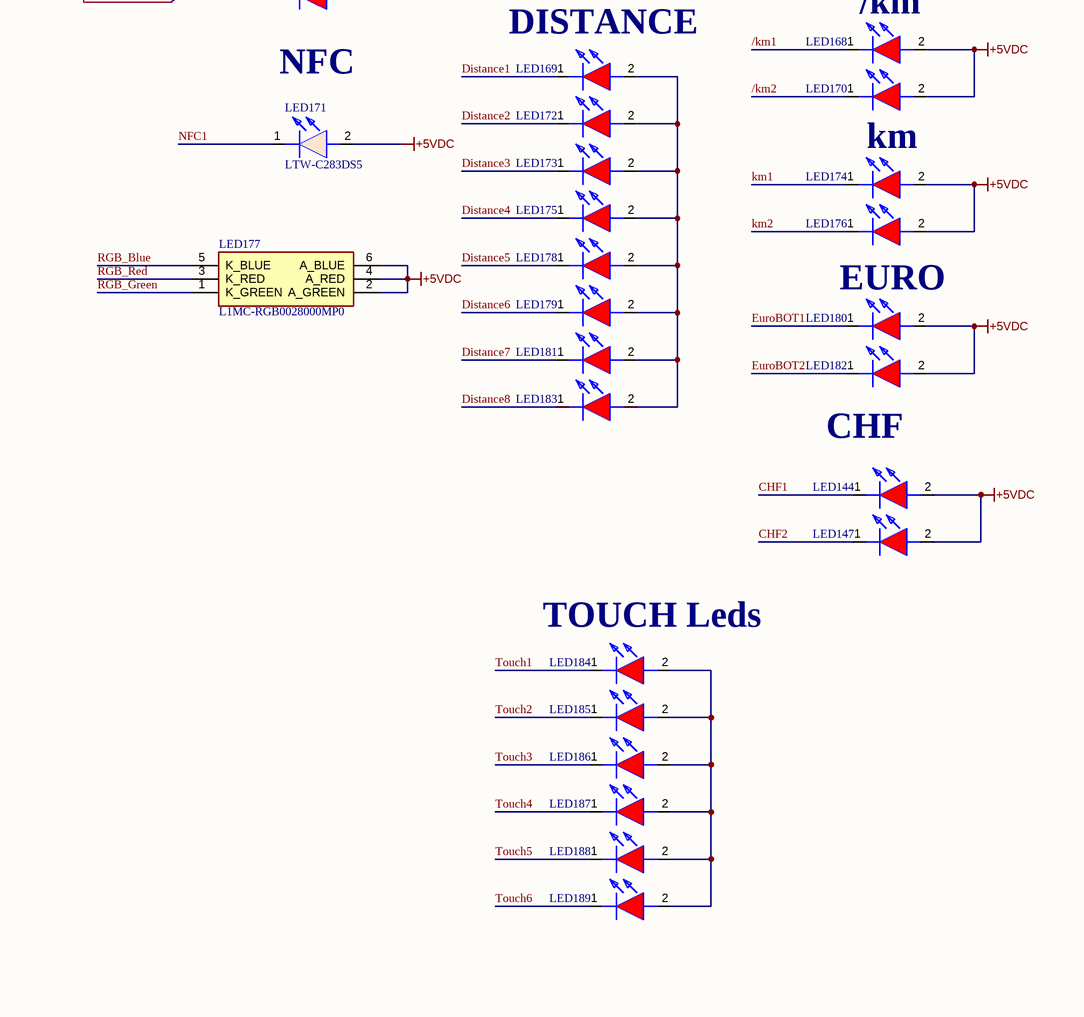
[diagram p7: 09_Display_Leds-2.SchDoc, bottom right]

### Parts
C87  value 100nF  Voltage: 50V  [CAP_0603]  (hidden comment: CAP)
C88  value 100nF  Voltage: 50V  [CAP_0603]  (hidden comment: CAP)
C89  value 100nF  Voltage: 50V  [CAP_0603]  (hidden comment: CAP)
C90  value 100nF  Voltage: 50V  [CAP_0603]  (hidden comment: CAP)
LED126  YLED0402R  [APHHS1005LSECKJ3PF]  (value not drawn)
LED127  YLED0402R  [APHHS1005LSECKJ3PF]  (value not drawn)
LED128  YLED0402R  [APHHS1005LSECKJ3PF]  (value not drawn)
LED129  YLED0402R  [APHHS1005LSECKJ3PF]  (value not drawn)
LED130  YLED0402R  [APHHS1005LSECKJ3PF]  (value not drawn)
LED131  YLED0402R  [APHHS1005LSECKJ3PF]  (value not drawn)
LED132  YLED0402R  [APHHS1005LSECKJ3PF]  (value not drawn)
LED133  YLED0402R  [APHHS1005LSECKJ3PF]  (value not drawn)
LED134  YLED0402R  [APHHS1005LSECKJ3PF]  (value not drawn)
LED135  YLED0402R  [APHHS1005LSECKJ3PF]  (value not drawn)
LED136  YLED0402R  [APHHS1005LSECKJ3PF]  (value not drawn)
LED137  YLED0402R  [APHHS1005LSECKJ3PF]  (value not drawn)
LED138  YLED0402R  [APHHS1005LSECKJ3PF]  (value not drawn)
LED139  YLED0402R  [APHHS1005LSECKJ3PF]  (value not drawn)
LED140  YLED0402R  [APHHS1005LSECKJ3PF]  (value not drawn)
LED141  YLED0402R  [APHHS1005LSECKJ3PF]  (value not drawn)
LED142  YLED0402R  [APHHS1005LSECKJ3PF]  (value not drawn)
LED143  YLED0402R  [APHHS1005LSECKJ3PF]  (value not drawn)
LED144  YLED0402R  [APHHS1005LSECKJ3PF]  (value not drawn)
LED145  YLED0402R  [APHHS1005LSECKJ3PF]  (value not drawn)
LED146  YLED0402R  [APHHS1005LSECKJ3PF]  (value not drawn)
LED147  YLED0402R  [APHHS1005LSECKJ3PF]  (value not drawn)
LED148  YLED0402R  [APHHS1005LSECKJ3PF]  (value not drawn)
LED149  YLED0402R  [APHHS1005LSECKJ3PF]  (value not drawn)
LED150  YLED0402R  [APHHS1005LSECKJ3PF]  (value not drawn)
LED151  YLED0402R  [APHHS1005LSECKJ3PF]  (value not drawn)
LED152  YLED0402R  [APHHS1005LSECKJ3PF]  (value not drawn)
LED153  YLED0402R  [APHHS1005LSECKJ3PF]  (value not drawn)
LED154  YLED0402R  [APHHS1005LSECKJ3PF]  (value not drawn)
LED155  YLED0402R  [APHHS1005LSECKJ3PF]  (value not drawn)
LED156  YLED0402R  [APHHS1005LSECKJ3PF]  (value not drawn)
LED157  YLED0402R  [APHHS1005LSECKJ3PF]  (value not drawn)
LED158  YLED0402R  [APHHS1005LSECKJ3PF]  (value not drawn)
LED159  YLED0402R  [APHHS1005LSECKJ3PF]  (value not drawn)
LED160  YLED0402R  [APHHS1005LSECKJ3PF]  (value not drawn)
LED161  YLED0402R  [APHHS1005LSECKJ3PF]  (value not drawn)
LED162  YLED0402R  [APHHS1005LSECKJ3PF]  (value not drawn)
LED163  YLED0402R  [APHHS1005LSECKJ3PF]  (value not drawn)
LED164  YLED0402R  [APHHS1005LSECKJ3PF]  (value not drawn)
LED165  YLED0402R  [APHHS1005LSECKJ3PF]  (value not drawn)
LED166  YLED0402R  [APHHS1005LSECKJ3PF]  (value not drawn)
LED167  YLED0402R  [APHHS1005LSECKJ3PF]  (value not drawn)
LED168  YLED0402R  [APHHS1005LSECKJ3PF]  (value not drawn)
LED169  YLED0402R  [APHHS1005LSECKJ3PF]  (value not drawn)
LED170  YLED0402R  [APHHS1005LSECKJ3PF]  (value not drawn)
LED171  LTW-C283DS5  [APHHS1005LSECKJ3PF]
LED172  YLED0402R  [APHHS1005LSECKJ3PF]  (value not drawn)
LED173  YLED0402R  [APHHS1005LSECKJ3PF]  (value not drawn)
LED174  YLED0402R  [APHHS1005LSECKJ3PF]  (value not drawn)
LED175  YLED0402R  [APHHS1005LSECKJ3PF]  (value not drawn)
LED176  YLED0402R  [APHHS1005LSECKJ3PF]  (value not drawn)
LED177  L1MC-RGB0028000MP0  [L1MCRGB0028000MP0]
LED178  YLED0402R  [APHHS1005LSECKJ3PF]  (value not drawn)
LED179  YLED0402R  [APHHS1005LSECKJ3PF]  (value not drawn)
LED180  YLED0402R  [APHHS1005LSECKJ3PF]  (value not drawn)
LED181  YLED0402R  [APHHS1005LSECKJ3PF]  (value not drawn)
LED182  YLED0402R  [APHHS1005LSECKJ3PF]  (value not drawn)
LED183  YLED0402R  [APHHS1005LSECKJ3PF]  (value not drawn)
LED184  YLED0402R  [APHHS1005LSECKJ3PF]  (value not drawn)
LED185  YLED0402R  [APHHS1005LSECKJ3PF]  (value not drawn)
LED186  YLED0402R  [APHHS1005LSECKJ3PF]  (value not drawn)
LED187  YLED0402R  [APHHS1005LSECKJ3PF]  (value not drawn)
LED188  YLED0402R  [APHHS1005LSECKJ3PF]  (value not drawn)
LED189  YLED0402R  [APHHS1005LSECKJ3PF]  (value not drawn)
R85  value 3.6K  [RES_0603]  (hidden comment: RC0603FR-133K6L)
R86  value 3.6K  [RES_0603]  (hidden comment: RC0603FR-133K6L)
R87  value 3.6K  [RES_0603]  (hidden comment: RC0603FR-133K6L)
R88  value 3.6K  [RES_0603]  (hidden comment: RC0603FR-133K6L)
U21  CAT4016HV6-GT2  [QFN50P400X400X80-25N-D]
U22  CAT4016HV6-GT2  [QFN50P400X400X80-25N-D]
U23  CAT4016HV6-GT2  [QFN50P400X400X80-25N-D]
U24  CAT4016HV6-GT2  [QFN50P400X400X80-25N-D]

### Ports
EEM1 (in), EEM2 (in), LED_DATA_OUT8 (in)

### Nets
+5VDC: C87.1 C88.1 C89.1 C90.1 LED126.2(A) LED127.2(A) LED128.2(A) LED129.2(A) LED130.2(A) LED131.2(A) LED132.2(A) LED133.2(A) LED134.2(A) LED135.2(A) LED136.2(A) LED137.2(A) LED138.2(A) LED139.2(A) LED140.2(A) LED141.2(A) LED142.2(A) LED143.2(A) LED144.2(A) LED145.2(A) LED146.2(A) LED147.2(A) LED148.2(A) LED149.2(A) LED150.2(A) LED151.2(A) LED152.2(A) LED153.2(A) LED154.2(A) LED155.2(A) LED156.2(A) LED157.2(A) LED158.2(A) LED159.2(A) LED160.2(A) LED161.2(A) LED162.2(A) LED163.2(A) LED164.2(A) LED165.2(A) LED166.2(A) LED167.2(A) LED168.2(A) LED170.2(A) LED171.2(A) LED174.2(A) LED176.2(A) LED177.2(A_GREEN) LED177.4(A_RED) LED177.6(A_BLUE) LED180.2(A) LED182.2(A) U21.24(VDD) U22.24(VDD) U23.24(VDD) U24.24(VDD)
GND: C87.2 C88.2 C89.2 C90.2 U21.1(GND) U22.1(GND) U23.1(GND) U24.1(GND)
/km1: LED168.1(K) U22.9(LED5)
/km2: LED170.1(K) U22.10(LED6)
Bed1: LED156.1(K) U22.15(LED11)
CHF1: LED144.1(K) U21.11(LED7)
CHF2: LED147.1(K) U21.12(LED8)
Clock1: LED160.1(K) U22.16(LED12)
Distance1: LED169.1(K) U24.5(LED1)
Distance2: LED172.1(K) U24.6(LED2)
Distance3: LED173.1(K) U24.7(LED3)
Distance4: LED175.1(K) U24.8(LED4)
Distance5: LED178.1(K) U24.9(LED5)
Distance6: LED179.1(K) U24.10(LED6)
Distance7: LED181.1(K) U24.11(LED7)
Distance8: LED183.1(K) U24.12(LED8)
EEM1: LED165.1(K) ; port EEM1
EEM2: LED167.1(K) ; port EEM2
EuroBOT1: LED180.1(K) U22.13(LED9)
EuroBOT2: LED182.1(K) U22.14(LED10)
EuroTOP1: LED162.1(K) U22.7(LED3)
EuroTOP2: LED164.1(K) U22.8(LED4)
Extras1: LED139.1(K) U21.13(LED9)
Extras2: LED142.1(K) U21.14(LED10)
Extras3: LED145.1(K) U21.15(LED11)
Extras4: LED148.1(K) U21.16(LED12)
Extras5: LED149.1(K) U21.17(LED13)
Extras6: LED152.1(K) U21.18(LED14)
Extras7: LED154.1(K) U21.19(LED15)
Extras8: LED155.1(K) U21.20(LED16)
Fare1: LED127.1(K) U21.5(LED1)
Fare2: LED130.1(K) U21.6(LED2)
Fare3: LED133.1(K) U21.7(LED3)
Fare4: LED137.1(K) U21.8(LED4)
Fare5: LED138.1(K) U21.9(LED5)
Fare6: LED141.1(K) U21.10(LED6)
Forhere1: LED140.1(K) U23.17(LED13)
Forhere2: LED143.1(K) U23.18(LED14)
Forhere3: LED146.1(K) U23.19(LED15)
Hired1: LED126.1(K) U23.5(LED1)
Hired2: LED129.1(K) U23.6(LED2)
Hired3: LED132.1(K) U23.7(LED3)
Hired4: LED135.1(K) U23.8(LED4)
km1: LED174.1(K) U22.11(LED7)
km2: LED176.1(K) U22.12(LED8)
LED_BLANK: U21.21(BLANK) U22.21(BLANK) U23.21(BLANK) U24.21(BLANK)
LED_DATA_OUT9: U21.22(SOUT) U23.2(SIN)
LED_DATA_OUT10: U23.22(SOUT) U24.2(SIN)
LED_DATA_OUT11: U22.2(SIN) U24.22(SOUT)
LED_DR_CLK: U21.3(CLK) U22.3(CLK) U23.3(CLK) U24.3(CLK)
LED_DR_LATCH: U21.4(LATCH) U22.4(LATCH) U23.4(LATCH) U24.4(LATCH)
NFC1: LED171.1(K) U22.17(LED13)
NH1: LED157.1(K) U22.5(LED1)
NH2: LED158.1(K) U22.6(LED2)
Rate1: LED159.1(K) U23.13(LED9)
Rate2: LED161.1(K) U23.14(LED10)
Rate3: LED163.1(K) U23.15(LED11)
Rate4: LED166.1(K) U23.16(LED12)
RGB_Blue: LED177.5(K_BLUE) U22.18(LED14)
RGB_Green: LED177.1(K_GREEN) U22.20(LED16)
RGB_Red: LED177.3(K_RED) U22.19(LED15)
Service1: LED151.1(K) U23.20(LED16)
Stopped1: LED128.1(K) U23.9(LED5)
Stopped2: LED131.1(K) U23.10(LED6)
Stopped3: LED134.1(K) U23.11(LED7)
Stopped4: LED136.1(K) U23.12(LED8)
Taxi1: LED150.1(K) U24.19(LED15)
Taxi2: LED153.1(K) U24.20(LED16)
Touch1: LED184.1(K) U24.13(LED9)
Touch2: LED185.1(K) U24.14(LED10)
Touch3: LED186.1(K) U24.15(LED11)
Touch4: LED187.1(K) U24.16(LED12)
Touch5: LED188.1(K) U24.17(LED13)
Touch6: LED189.1(K) U24.18(LED14)
NetLED169_2: LED169.2(A) LED172.2(A) LED173.2(A) LED175.2(A) LED178.2(A) LED179.2(A) LED181.2(A) LED183.2(A)
NetLED184_2: LED184.2(A) LED185.2(A) LED186.2(A) LED187.2(A) LED188.2(A) LED189.2(A)
NetR85_1: R85.1 U21.23(RSET)
NetR86_1: R86.1 U22.23(RSET)
NetR87_1: R87.1 U23.23(RSET)
NetR88_1: R88.1 U24.23(RSET)
NetU18_22: U21.2(SIN) ; port LED_DATA_OUT8

Not connected (* = marked no-connect by the designer): R85 2; R86 2; R87 2; R88 2; U21 25(EP); U22 22(SOUT)* 25(EP); U23 25(EP); U24 25(EP)

### Notes on the sheet
- (near LED127) FARE
- (near LED126) HIRED
- (near LED128) STOPPED
- (near LED135) EXTRAS
- FOR HERE
- (near LED151) SERVICE
- TAXI
- (near LED156) BED
- N/H
- CLOCK
- (near LED155) RATE
- EURO
- EEM
- NFC
- DISTANCE
- /km
- km
- CHF
- (near LED184) TOUCH Leds
- DWG. NO.
- REV.
- SHT.
- REVISION
- DESCRIPTION
- DATE
- APPROVED
- THIS DOCUMENT AND THE DATA DISCLOSED HEREIN OR HEREWITH IS THE PROPERTY OF ALTIUM LIMITED AND MAY BE FREELY DISTRIBUTED IN WHOLE. NO RIGHTS ARE RESERVED OR EXPRESS OR IMPLIED WARANTEE GIVEN.
- ENG:
- DSN:
- APPROVALS
- PROJECT
- DOCUMENT REVISION:
- DESIGN ITEM:
- CHK:
- BOM:
- REFERENCE DOCUMENTS
- PROJECT REVISION:
- TITLE
- FAB DWG:
- PCB DWG:
- ASSY DWG:
- SCALE:
- SIZE
- C
- CAGE CODE
- FILE NAME
- DWG NO.
- SHEET
- OF
- REV

### Library data of the parts
C87-C90 = C01763: as C79 on sheet 08_Display_Leds
LED126-LED170 LED172-LED176 LED178-LED189 = YLED0402R: as LED1 on sheet 08_Display_Leds; Manufacturer Part Number: YLED0402R
LED171 = LTW-C283DS5: LED WHITE YELLOW LENS 0402 SMD; Manufacturer: LITEON; Value: 0402; Manufacturer Part Number: LTW-C283DS5
LED177 = L1MC-RGB0028000MP0: LED; Manufacturer_Name: Lumileds; Datasheet Link: https://lumileds.com/wp-content/uploads/2022/03/DS388-luxeon-3528-rgb-datasheet.pdf; Height: 1.85mm; Manufacturer_Part_Number: L1MC-RGB0028000MP0; Mouser Part Number: 997-L1MCRGB00280MP; Mouser Price/Stock: https://www.mouser.co.uk/ProductDetail/Lumileds/L1MC-RGB0028000MP0?qs=Znm5pLBrcAJSGF05jr80lQ%3D%3D; Arrow Part Number: L1MC-RGB0028000MP0; Arrow Price/Stock: https://www.arrow.com/en/products/l1mc-rgb0028000mp0/lumileds.html?utm_currency=USD&region=nac
R85-R88 = 0603SAF3301T5E: as R77 on sheet 08_Display_Leds; Manufacturer Part Number: RC0603FR-133K6L
U21-U24 = CAT4016HV6-GT2: as U13 on sheet 08_Display_Leds; Datasheet Link: https://www.onsemi.com/download/data-sheet/pdf/cat4016-d.pdf; Height: 0.8mm; Manufacturer_Part_Number: CAT4016HV6-GT2; Mouser Part Number: 698-CAT4016HV6-GT2; Mouser Price/Stock: https://www.mouser.co.uk/ProductDetail/onsemi/CAT4016HV6-GT2?qs=rZgeL6XvLwaPp0eUTTX%2FiA%3D%3D; Arrow Part Number: CAT4016HV6-GT2; Arrow Price/Stock: https://www.arrow.com/en/products/cat4016hv6-gt2/on-semiconductor

## Sheet 05_USB_UART_Service.SchDoc: USB_UART_Service
size A4; SheetNumber: 6; SheetTotal: 12
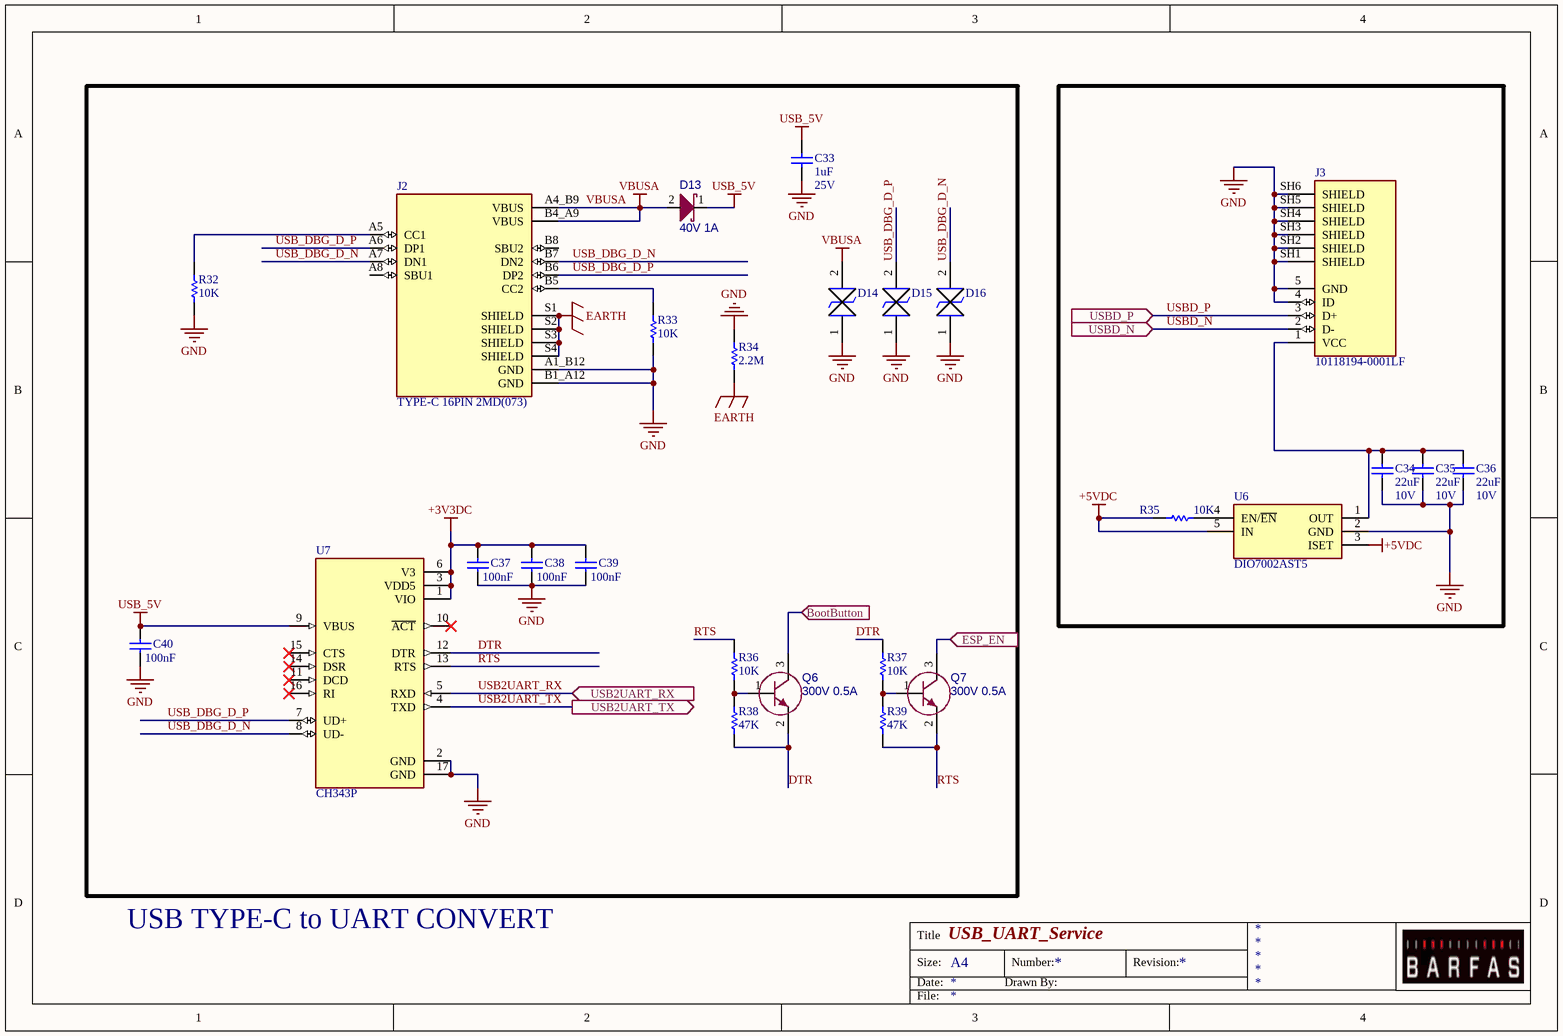
[diagram p8: 05_USB_UART_Service.SchDoc]

### Parts
C33  value 1uF  Voltage: 25V  [CAP_0603]  (hidden comment: CL10A105KA8NNNC)
C34  value 22uF  Voltage: 10V  [CAP_0805]  (hidden comment: CL21A226MPCLRNC)
C35  value 22uF  Voltage: 10V  [CAP_0805]  (hidden comment: CL21A226MPCLRNC)
C36  value 22uF  Voltage: 10V  [CAP_0805]  (hidden comment: CL21A226MPCLRNC)
C37  value 100nF  [CAP_0603]  (hidden comment: CL10B104KB8NNNL)
C38  value 100nF  [CAP_0603]  (hidden comment: CL10B104KB8NNNL)
C39  value 100nF  [CAP_0603]  (hidden comment: CL10B104KB8NNNL)
C40  value 100nF  [CAP_0603]  (hidden comment: CL10B104KB8NNNL)
D13  value 40V 1A  [SOD-123]  (hidden comment: PMEG4010EGWJ)
D14  ATV02W5V0B-HF  [SOD-123F]  (value not drawn)
D15  ATV02W5V0B-HF  [SOD-123F]  (value not drawn)
D16  ATV02W5V0B-HF  [SOD-123F]  (value not drawn)
J2  TYPE-C 16PIN 2MD(073)  [HRO_TYPE-C-31-M-12]
J3  10118194-0001LF  [AMPHENOL_10118194-0001LF]
Q6  value 300V 0.5A  [SOT-23-3]  (hidden comment: MMBTA42_R1_00001)
Q7  value 300V 0.5A  [SOT-23-3]  (hidden comment: MMBTA42_R1_00001)
R32  value 10K  [RES_0402]  (hidden comment: RC0402JR-0710KL)
R33  value 10K  [RES_0402]  (hidden comment: RC0402JR-0710KL)
R34  value 2.2M  [RES_0805]  (hidden comment: RES)
R35  value 10K  [RES_0402]  (hidden comment: RC0402JR-0710KL)
R36  value 10K  [RES_0402]  (hidden comment: RC0402JR-0710KL)
R37  value 10K  [RES_0402]  (hidden comment: RC0402JR-0710KL)
R38  value 47K  [RES_0603]  (hidden comment: 0603SAF4702T5E)
R39  value 47K  [RES_0603]  (hidden comment: 0603SAF4702T5E)
U6  DIO7002AST5  [SOT95P280X125-5N]
U7  CH343P  [QFN50P300X300X80-17N]

### Ports
BootButton (in), ESP_EN (in), USB2UART_RX (in), USB2UART_TX (out), USBD_N (in), USBD_P (in)

### Nets
+3V3DC: C37.2 C38.2 C39.2 U7.1(VIO) U7.3(VDD5) U7.6(V3)
+5VDC: R35.2 U6.3(ISET) U6.5(IN)
EARTH: J2.S1(SHIELD) J2.S2(SHIELD) J2.S3(SHIELD) J2.S4(SHIELD) R34.1
GND: C33.2 C34.2 C35.2 C36.2 C37.1 C38.1 C39.1 C40.1 D14.1 D15.1 D16.1 J2.A1_B12(GND) J2.B1_A12(GND) J3.4(ID) J3.5(GND) J3.SH1(SHIELD) J3.SH2(SHIELD) J3.SH3(SHIELD) J3.SH4(SHIELD) J3.SH5(SHIELD) J3.SH6(SHIELD) R32.1 R33.1 R34.2 U6.2(GND) U7.2(GND) U7.17(GND)
USB_5V: C33.1 C40.2 D13.1 U7.9(VBUS)
VBUSA: D13.2 D14.2 J2.A4_B9(VBUS) J2.B4_A9(VBUS)
DTR: Q6.2(E) R37.2 R38.1 U7.12(DTR)
RTS: Q7.2(E) R36.2 R39.1 U7.13(RTS)
USB2UART_RX: U7.5(RXD) ; port USB2UART_RX
USB2UART_TX: U7.4(TXD) ; port USB2UART_TX
USB_DBG_D_N: D16.2 J2.A7(DN1) J2.B7(DN2) U7.8(UD-)
USB_DBG_D_P: D15.2 J2.A6(DP1) J2.B6(DP2) U7.7(UD+)
USBD_N: J3.2(D-) ; port USBD_N
USBD_P: J3.3(D+) ; port USBD_P  [project net USBD_N]
NetC34_1: C34.1 C35.1 C36.1 J3.1(VCC) U6.1(OUT)
NetJ2_A5: J2.A5(CC1) R32.2
NetJ2_B5: J2.B5(CC2) R33.2
NetQ6_1: Q6.1(B) R36.1 R38.2
NetQ6_3: Q6.3(C) ; port BootButton
NetQ7_1: Q7.1(B) R37.1 R39.2
NetQ7_3: Q7.3(C) ; port ESP_EN
NetR35_1: R35.1 U6.4(EN/~{EN})

Not connected (* = marked no-connect by the designer): J2 A8(SBU1) B8(SBU2); U7 10(~{ACT})* 11(DCD)* 14(DSR)* 15(CTS)* 16(RI)*

### Notes on the sheet
- USB TYPE-C to UART CONVERT
- Title
- Size:
- Date:
- A4
- Drawn By:
- Number:
- Revision:
- File:

### Library data of the parts
C33 = C01757: CAP CER 1UF 25VDC %10 X5R SMD; Manufacturer: Samsung; Manufacturer Part Number: CL10A105KA8NNNC
C34-C36 = C01758: MLCC (2012) 0805 22uF 10VDC ±20% X5R; Manufacturer: Samsung; Manufacturer Part Number: CL21A226MPCLRNC
C37-C40 = CL10B104KB8NNNL: MLCC (1608) 0603 100nF 50VDC ±10% X7R; Manufacturer: Samsung Electro-Mechanics America, Inc; Supplier 1: OZDISAN; Manufacturer Part Number: CL10B104KB8NNNL
D13 = PMEG4010EGWJ: DIODE SCHOTTKY 40V 1A SOD123; Manufacturer: Nexperia USA Inc.; Manufacturer Part Number: PMEG4010EGWJ
D14-D16 = ATV02W5V0B-HF: TVS Diode (Bi-directional); Manufacturer: Comchip Technology; Manufacturer Part Number: ATV02W5V0B-HF
J2 = TYPE-C-31-M-12: CONN RCPT Type-C 16POS SMD R/A; Manufacturer: SHOU HAN; Value: *; Manufacturer Part Number: TYPE-C 16PIN 2MD(073)
J3 = 10118194-0001LF: Micro USB, Input Output Connectors, B TYPE RECEPTACLE with flange; MF: Amphenol ICC; SnapEDA_Link: https://www.snapeda.com/parts/10118194-0001LF/Amphenol+FCI/view-part/?ref=snap; Package: None; Value: *; MP: 10118194-0001LF; Check_prices: https://www.snapeda.com/parts/10118194-0001LF/Amphenol+FCI/view-part/?ref=eda
Q6 Q7 = MMBTA42_R1_00001: TRANSISTOR DIS.500mA 300V NPN SOT23 GEN. SMT; Manufacturer: PANJIT; Package: SOT23; Supplier Part Number 1: 3757-MMBTA42_R1_00001CT-ND; Supplier Part Number 2: *; Supplier Part Number 3: MMBTA42_R1_00001; Supplier 1: DIGIKEY; Supplier 2: MOUSER; Supplier 3: OZDISAN; Manufacturer Part Number: MMBTA42_R1_00001
R32 R33 R35-R37 = R03000: RES.(1005) 0402 10K Ohms 5% 1/16W 100PPM SMT; Manufacturer: YAGEO; Manufacturer Part Number: RC0402JR-0710KL
R34 = R01913: RES SMD 2.2M OHM 1% 1/8W 0805; Manufacturer: Yageo; Manufacturer Part Number: RC0805FR-072M2L
R38 R39 = 0603SAF4702T5E: RES.(1608) 0603 47K Ohms 1% 1/10W-S 100PPM; Manufacturer: ROYALOHM; Supplier 1: Ozdisan; Manufacturer Part Number: 0603SAF4702T5E
U6 = DIO7002AST5: Low Loss Power Distribution Switch; Manufacturer: DIOO Microcircuits; Manufacturer Part Number: DIO7002AST5
U7 = CH343P: USB to High-Speed Serial Chip CH343; Manufacturer: WCH; SnapEDA_Link: https://www.snapeda.com/parts/CH343P/WCH/view-part/?ref=snap; Package: Package; Value: *; Manufacturer Part Number: CH343P; Check_prices: https://www.snapeda.com/parts/CH343P/WCH/view-part/?ref=eda

## Sheet 06_RFID_RTC_Storage.SchDoc: RFID_RTC_Storage
size A4; SheetNumber: 7; SheetTotal: 12
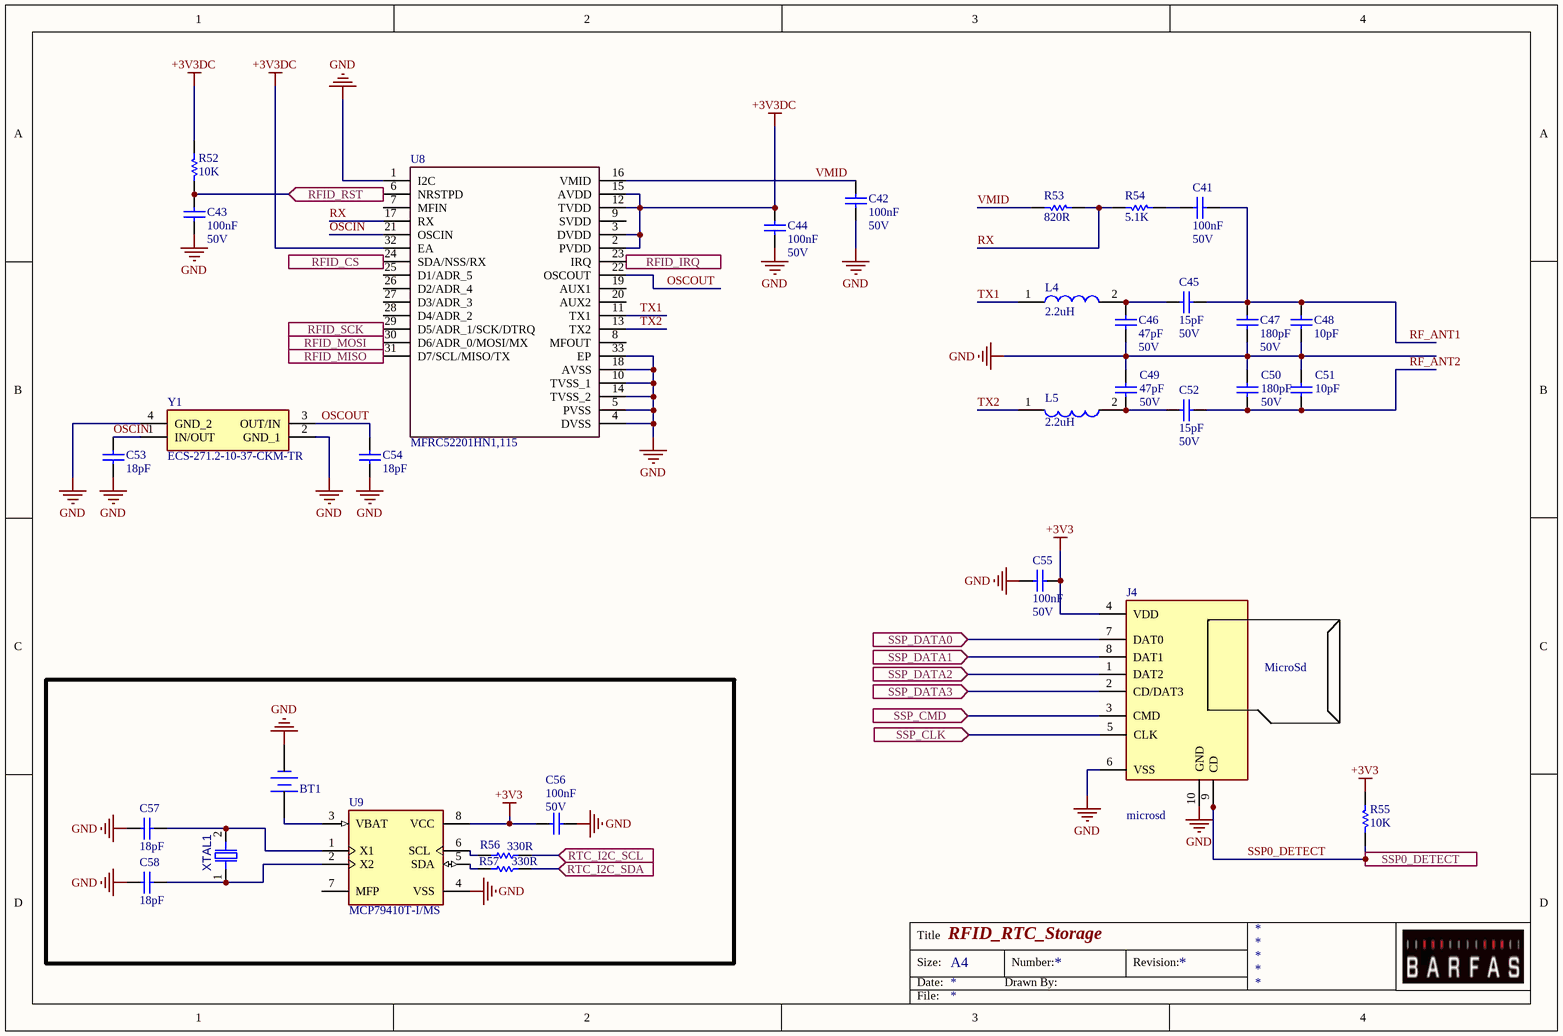
[diagram p9: 06_RFID_RTC_Storage.SchDoc]

### Parts
BT1  DS1092-04-B6P  [DB1092]  (value not drawn)
C41  value 100nF  Voltage: 50V  [CAP_0603]  (hidden comment: CAP)
C42  value 100nF  Voltage: 50V  [CAP_0603]  (hidden comment: CAP)
C43  value 100nF  Voltage: 50V  [CAP_0603]  (hidden comment: CAP)
C44  value 100nF  Voltage: 50V  [CAP_0603]  (hidden comment: CAP)
C45  value 15pF  Voltage: 50V  [CAP_0603]  (hidden comment: CL10C150JB8NNNC)
C46  value 47pF  Voltage: 50V  [CAP_0603]  (hidden comment: CL10C470JB8NNNC)
C47  value 180pF  Voltage: 50V  [CAP_0603]  (hidden comment: CL10C181JB8NNNC)
C48  value 10pF  [CAP_0603]  (hidden comment: CL10C100CB8NNNC)
C49  value 47pF  Voltage: 50V  [CAP_0603]  (hidden comment: CL10C470JB8NNNC)
C50  value 180pF  Voltage: 50V  [CAP_0603]  (hidden comment: CL10C181JB8NNNC)
C51  value 10pF  [CAP_0603]  (hidden comment: CL10C100CB8NNNC)
C52  value 15pF  Voltage: 50V  [CAP_0603]  (hidden comment: CL10C150JB8NNNC)
C53  value 18pF  [CAP_0603]  (hidden comment: CL10C180JB8NNNC)
C54  value 18pF  [CAP_0603]  (hidden comment: CL10C180JB8NNNC)
C55  value 100nF  Voltage: 50V  [CAP_0603]  (hidden comment: CAP)
C56  value 100nF  Voltage: 50V  [CAP_0603]  (hidden comment: CAP)
C57  value 18pF  [CAP_0603]  (hidden comment: CL10C180JB8NNNC)
C58  value 18pF  [CAP_0603]  (hidden comment: CL10C180JB8NNNC)
J4  microsd  [microSD_2]
L4  value 2.2uH  [LQM18PN1R0NC0L]  (hidden comment: LQM18PN2R2NC0L)
L5  value 2.2uH  [LQM18PN1R0NC0L]  (hidden comment: LQM18PN2R2NC0L)
R52  value 10K  [RES_0603]  (hidden comment: RES)
R53  value 820R  [RES_0603]  (hidden comment: 0603SAJ0821T5E)
R54  value 5.1K  [RES_0603]  (hidden comment: RC0603FR-075K1L)
R55  value 10K  [RES_0603]  (hidden comment: RES)
R56  value 330R  [RES_0603]  (hidden comment: 0603SAF3300T5E)
R57  value 330R  [RES_0603]  (hidden comment: 0603SAF3300T5E)
U8  MFRC52201HN1,115  [QFN50P500X500X100-33N-D]
U9  MCP79410T-I/MS  [8_MSOP]
XTAL1  R38-32.768-12.5-EXT-5PPM  [R38_THT_2]  (value not drawn)
Y1  ECS-271.2-10-37-CKM-TR  [ECS27121037CKMTR]

### Ports
RFID_CS (in), RFID_IRQ (in), RFID_MISO (in), RFID_MOSI (in), RFID_RST (in), RFID_SCK (in), RTC_I2C_SCL (in), RTC_I2C_SDA (in), SSP0_DETECT (in), SSP_CLK (in), SSP_CMD (in), SSP_DATA0 (in), SSP_DATA1 (in), SSP_DATA2 (in), SSP_DATA3 (in)

### Nets
+3V3: C55.1 C56.2 J4.4(VDD) R55.1 U9.8(VCC)
+3V3DC: C44.2 R52.1 U8.2(PVDD) U8.3(DVDD) U8.12(TVDD) U8.15(AVDD) U8.32(EA)
GND: BT1.1 C42.1 C43.1 C44.1 C46.2 C47.2 C48.1 C49.1 C50.1 C51.2 C53.1 C54.1 C55.2 C56.1 C57.1 C58.1 J4.6(VSS) J4.10(GND) U8.1(I2C) U8.4(DVSS) U8.5(PVSS) U8.10(TVSS_1) U8.14(TVSS_2) U8.18(AVSS) U8.33(EP) U9.4(VSS) Y1.2(GND_1) Y1.4(GND_2)
OSCIN: C53.2 U8.21(OSCIN) Y1.1(IN/OUT)
OSCOUT: C54.2 U8.22(OSCOUT) Y1.3(OUT/IN)
RF_ANT1: C41.1 C45.1 C47.1 C48.2
RF_ANT2: C50.2 C51.1 C52.1
RFID_CS: U8.24(SDA/NSS/RX) ; port RFID_CS
RFID_IRQ: U8.23(IRQ) ; port RFID_IRQ
RFID_MISO: U8.31(D7/SCL/MISO/TX) ; port RFID_MISO
RFID_MOSI: U8.30(D6/ADR_0/MOSI/MX) ; port RFID_MOSI
RFID_RST: C43.2 R52.2 U8.6(NRSTPD) ; port RFID_RST
RFID_SCK: U8.29(D5/ADR_1/SCK/DTRQ) ; port RFID_SCK
RTC_I2C_SCL: R56.2 ; port RTC_I2C_SCL
RTC_I2C_SDA: R57.2 ; port RTC_I2C_SDA
RX: R53.2 R54.1 U8.17(RX)
SSP0_DETECT: J4.9(CD) R55.2 ; port SSP0_DETECT
SSP_CLK: J4.5(CLK) ; port SSP_CLK
SSP_CMD: J4.3(CMD) ; port SSP_CMD
SSP_DATA0: J4.7(DAT0) ; port SSP_DATA0
SSP_DATA1: J4.8(DAT1) ; port SSP_DATA1
SSP_DATA2: J4.1(DAT2) ; port SSP_DATA2
SSP_DATA3: J4.2(CD/DAT3) ; port SSP_DATA3
TX1: L4.1 U8.11(TX1)
TX2: L5.1 U8.13(TX2)
VMID: C42.2 R53.1 U8.16(VMID)
NetBT1_2: BT1.2 U9.3(VBAT)
NetC41_2: C41.2 R54.2
NetC45_2: C45.2 C46.1 L4.2
NetC49_2: C49.2 C52.2 L5.2
NetC57_2: C57.2 U9.1(X1) XTAL1.2
NetC58_2: C58.2 U9.2(X2) XTAL1.1
NetR56_1: R56.1 U9.6(SCL)
NetR57_1: R57.1 U9.5(SDA)

Not connected (* = marked no-connect by the designer): U8 7(MFIN) 8(MFOUT) 9(SVDD) 19(AUX1) 20(AUX2) 25(D1/ADR_5) 26(D2/ADR_4) 27(D3/ADR_3) 28(D4/ADR_2); U9 7(MFP)

### Notes on the sheet
- Title
- Size:
- Date:
- A4
- Drawn By:
- Number:
- Revision:
- File:
- (in symbol microsd) MicroSd

### Library data of the parts
BT1 = DS1092-04-B6P: BATTERY HOLDER FOR CR2032 HORIZONTAL FEMALE; Manufacturer: CONNFLY; Manufacturer Part Number: DS1092-04-B6P; Supplier 1: Ozdisan
C41-C44 C55 C56 = C01763: as C79 on sheet 08_Display_Leds
C45 C52 = C01763: MLCC (1608) 0603 15pF 50VDC ±5% C0G (NP0); Manufacturer: Samsung; Manufacturer Part Number: CL10C150JB8NNNC
C46 C49 = C01763: MLCC (1608) 0603 47pF 50VDC ±5% C0G (NP0); Manufacturer: Samsung; Manufacturer Part Number: CL10C470JB8NNNC
C47 C50 = C01763: MLCC (1608) 0603 180pF 50VDC ±5% C0G (NP0); Manufacturer: Samsung; Manufacturer Part Number: CL10C181JB8NNNC
C48 C51 = CL10C100CB8NNNC: MLCC (1608) 0603 10pF 50VDC ±0.25pF C0G (NP0); Manufacturer: SAMSUNG; Supplier 1: Ozdisan; Manufacturer Part Number: CL10C100CB8NNNC
C53 C54 C57 C58 = CL10C180JB8NNNC: MLCC (1608) 0603 18pF 50VDC ±5% C0G (NP0); Manufacturer: Samsung Electro-Mechanics America, Inc; Supplier 1: OZDISAN; Manufacturer Part Number: CL10C180JB8NNNC
J4 = microsd: Connector; Part Number: L-KLS1-TF-003-H1.85-R; Unit: USD; Price: 0,26439; Ordering: https://www.ozdisan.com/konnektor-baglanti-elemanlari/sim-sd-kart-konnektorleri/sd-kart-konnektorleri/L-KLS1-TF-003-H1-85-R
L4 L5 = LQM18PN2R2NC0L: FIXED IND 2.2UH 700MA 300 MOHM; Manufacturer: Murata Electronics; Manufacturer Part Number: LQM18PN2R2NC0L
R52 R55 = R02995: RES 0603 10k Ohms %1 1/10W 100PPM; Manufacturer: ROYALOHM; Manufacturer Part Number: 0603SAF1002T5E
R53 = R02995: RES.(1608) 0603 820 Ohms 5% 1/10W-S 100PPM; Manufacturer: ROYALOHM; Manufacturer Part Number: 0603SAJ0821T5E
R54 = R02995: RES 5.1K OHM 1% 1/10W 0603; Manufacturer: YAGEO; Manufacturer Part Number: RC0603FR-075K1L
R56 R57 = 0603SAF3300T5E: RES.(1608) 0603 330 Ohms 1% 1/10W-S 100PPM; Manufacturer: ROYALOHM; Supplier 1: Ozdisan; Manufacturer Part Number: 0603SAF3300T5E
U8 = MFRC52201HN1,115: Integrated Circuit; Manufacturer_Name: NXP; Datasheet Link: https://media.digikey.com/pdf/Data%20Sheets/NXP%20PDFs/MFRC522.pdf; Height: 1mm; Manufacturer_Part_Number: MFRC52201HN1,115; Mouser Part Number: 771-MFRC52201HN1115; Mouser Price/Stock: https://www.mouser.co.uk/ProductDetail/NXP-Semiconductors/MFRC52201HN1115?qs=cbprxTG2Yq8gosQeFVBvCQ%3D%3D; Arrow Part Number: MFRC52201HN1,115; Arrow Price/Stock: https://www.arrow.com/en/products/mfrc52201hn1115/nxp-semiconductors?utm_currency=USD&region=nac
U9 = MCP79410T-I/MS: Real Time Clock (RTC) IC Clock/Calendar 64B, 1Kb I²C, 2-Wire Serial 8-TSSOP, 8-MSOP (0.118", 3.00mm Width); Manufacturer: Microchip Technology; Value: *; Supplier 1: DIGIKEY; Manufacturer Part Number: MCP79410T-I/MS
XTAL1 = R38-32.768-12.5-EXT-5PPM: CRYSTAL 32.768KHZ 12.5pF BULK 5ppm 3X8 EXT; Manufacturer: RALTRON; Manufacturer Part Number: R38-32.768-12.5-EXT-5PPM; Supplier 1: OZDISAN
Y1 = ECS-271.2-10-37-CKM-TR: 27.12 MHz ±10ppm Crystal 10pF 60 Ohms 4-SMD, No Lead; Manufacturer: ECS; Height: 0.55mm; Manufacturer Part Number: ECS-271.2-10-37-CKM-TR

## Nets that join several sheets
+3V3DC: 05_USB_UART_Service (6 pins), 06_RFID_RTC_Storage (7 pins)
+5VDC: 08_Display_Leds (141 pins), 09_Display_Leds-2 (60 pins), 05_USB_UART_Service (R35.2 U6.3 U6.5)
GND: 08_Display_Leds (16 pins), 09_Display_Leds-2 (8 pins), 05_USB_UART_Service (27 pins), 06_RFID_RTC_Storage (28 pins)
EEM1: 08_Display_Leds (U15.19), 09_Display_Leds-2 (LED165.1)
EEM2: 08_Display_Leds (U15.20), 09_Display_Leds-2 (LED167.1)
NetU18_22: 08_Display_Leds (U18.22), 09_Display_Leds-2 (U21.2)